# Altium project PY32E407Vx_START_ETH.PrjPcb
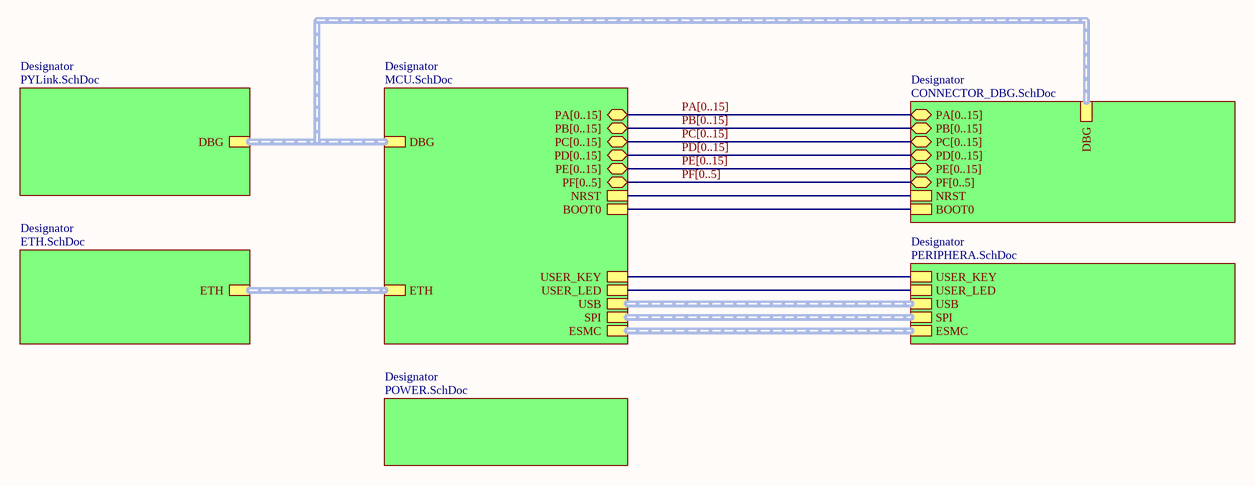
[diagram p0: TOP.SchDoc]
7 sheets, 253 parts. Net scope: hierarchical (ports join the sheet entries above them; power ports are global).
Board file: PY32E407Vx_START_ETH.PcbDoc
Sheets:
  TOP.SchDoc
    Designator = PYLink.SchDoc
    Designator = MCU.SchDoc
    Designator = ETH.SchDoc
    Designator = PERIPHERA.SchDoc
    Designator = CONNECTOR_DBG.SchDoc
    Designator = POWER.SchDoc

## Sheet TOP.SchDoc: TOP
size A4; Revision: V2.0; SheetNumber: 1; SheetTotal: 7; Project: PY32F403v1xT_START

### Sub-sheets
Designator = PYLink.SchDoc: DBG (harness QSPI)
Designator = MCU.SchDoc: PA[0..15] (bidir), PB[0..15] (bidir), PC[0..15] (bidir), PD[0..15] (bidir), PE[0..15] (bidir), NRST, BOOT0, ETH (harness QSPI), USB (harness QSPI), ESMC (harness QSPI), SPI (harness QSPI), DBG (harness QSPI), PF[0..5] (bidir), USER_KEY, USER_LED
Designator = ETH.SchDoc: ETH (harness QSPI)
Designator = PERIPHERA.SchDoc: USB (harness QSPI), ESMC (harness QSPI), SPI (harness QSPI), USER_KEY, USER_LED
Designator = CONNECTOR_DBG.SchDoc: PA[0..15] (bidir), PB[0..15] (bidir), PC[0..15] (bidir), PD[0..15] (bidir), PE[0..15] (bidir), NRST, BOOT0, DBG (harness QSPI), PF[0..5] (bidir)
Designator = POWER.SchDoc: no entries

### Nets
BOOT0: sheet Designator/BOOT0, sheet Designator/BOOT0
NRST: sheet Designator/NRST, sheet Designator/NRST
USER_KEY: sheet Designator/USER_KEY, sheet Designator/USER_KEY
USER_LED: sheet Designator/USER_LED, sheet Designator/USER_LED

### Buses and harness runs
bus PA[0..15] = sheet Designator/PA[0..15]
bus PB[0..15] = sheet Designator/PB[0..15]
bus PC[0..15] = sheet Designator/PC[0..15]
bus PD[0..15] = sheet Designator/PD[0..15]
bus PE[0..15] = sheet Designator/PE[0..15]
bus PF[0..5] = sheet Designator/PF[0..5]

### Notes on the sheet
- Title:
- Project:
- Size:
- Sheet:
- A4
- of
- Date:
- Revision:

## Sheet PYLink.SchDoc: PYLink
size A3; DrawnBy: lcg; Revision: V2.0; SheetNumber: 2; SheetTotal: 7; Project: PY32F403v1xT_START
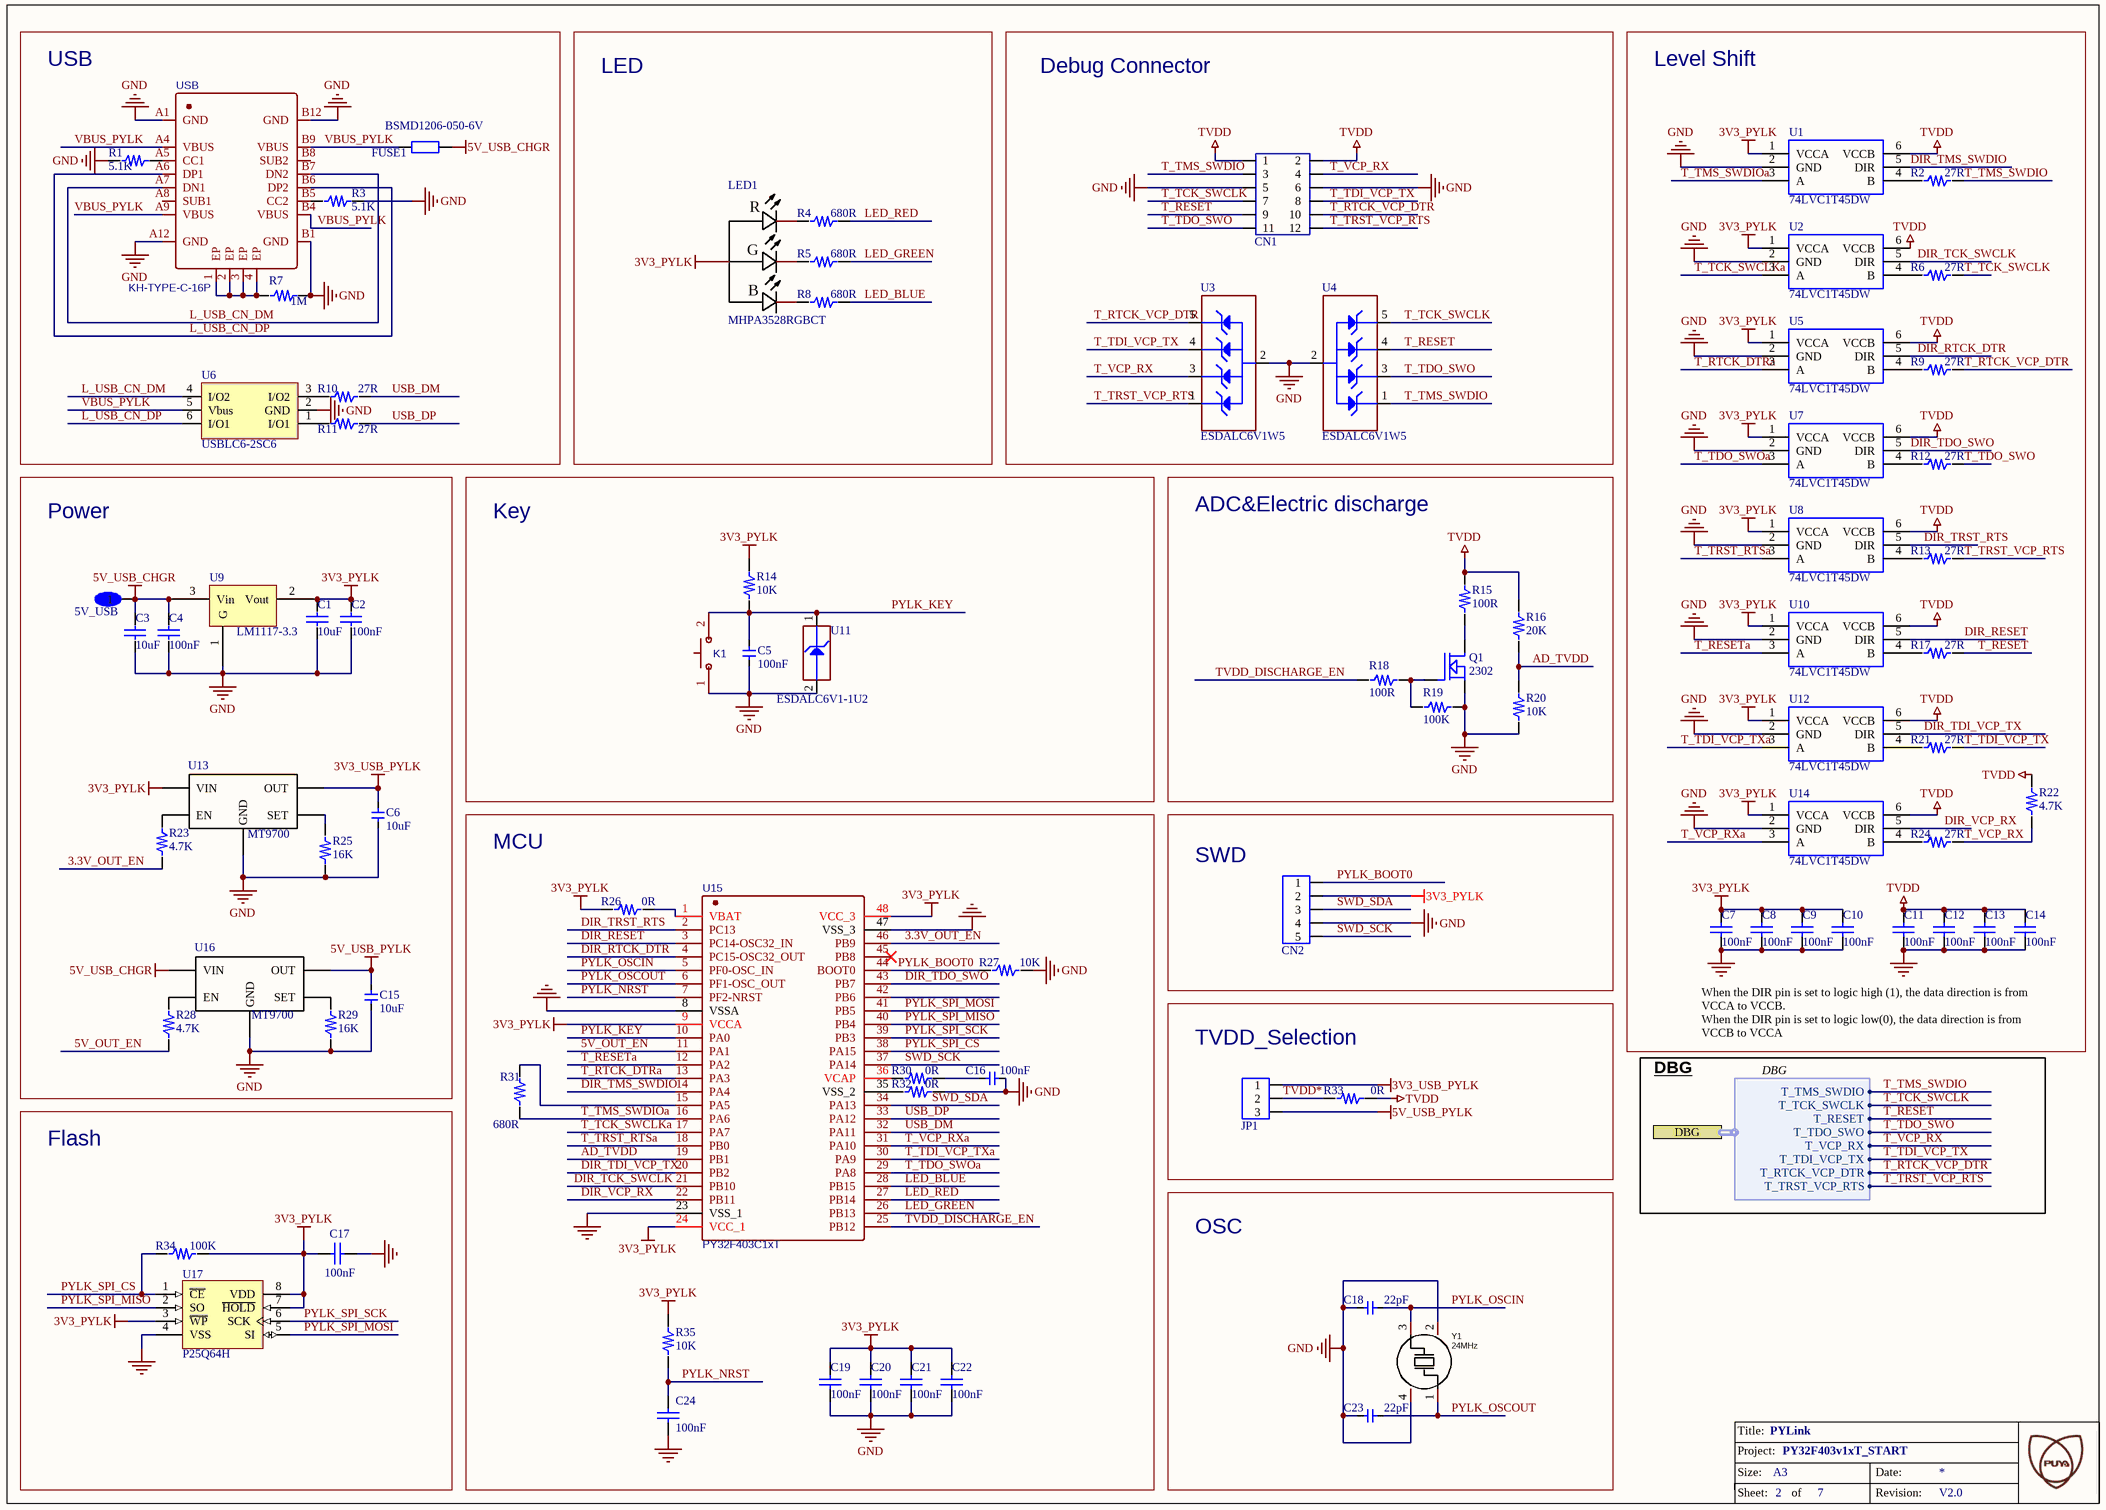
[diagram p1: PYLink.SchDoc]

### Parts
5V_USB  TP_SIN  [TP_SIN]  (value not drawn)
C1  10uF  [C0805]
C2  100nF  [C0603]
C3  10uF  [C0805]
C4  100nF  [C0603]
C5  100nF  [C0603]
C6  10uF  [C0805]
C7  100nF  [C0603]
C8  100nF  [C0603]
C9  100nF  [C0603]
C10  100nF  [C0603]
C11  100nF  [C0603]
C12  100nF  [C0603]
C13  100nF  [C0603]
C14  100nF  [C0603]
C15  10uF  [C0805]
C16  100nF  [C0603]
C17  100nF  [C0603]
C18  22pF  [C0603]
C19  100nF  [C0603]
C20  100nF  [C0603]
C21  100nF  [C0603]
C22  100nF  [C0603]
C23  22pF  [C0603]
C24  100nF  [C0603]
CN1  CON6x2  [CON6x2]  (value not drawn)
CN2  CON5  [CON5]  (value not drawn)
FUSE1  BSMD1206-050-6V  [SDM1210P005TF]
JP1  CON3  [CON3]  (value not drawn)
K1  1TS002B-2600-5001_key  [Switch]  (value not drawn)
LED1  MHPA3528RGBCT  [LED-ARRAY-SMD_4P-L3.5-W2.8-TL]
Q1  2302  [SOT23]
R1  5.1K  [R0603]
R2  27R  [R0603]
R3  5.1K  [R0603]
R4  680R  [R0603]
R5  680R  [R0603]
R6  27R  [R0603]
R7  1M  [R0603]
R8  680R  [R0603]
R9  27R  [R0603]
R10  27R  [R0603]
R11  27R  [R0603]
R12  27R  [R0603]
R13  27R  [R0603]
R14  10K  [R0603]
R15  100R  [R0805]
R16  20K  [R0603]
R17  27R  [R0603]
R18  100R  [R0603]
R19  100K  [R0603]
R20  10K  [R0603]
R21  27R  [R0603]
R22  4.7K  [R0603]
R23  4.7K  [R0603]
R24  27R  [R0603]
R25  16K  [R0603]
R26  0R  [R0603]
R27  10K  [R0603]
R28  4.7K  [R0603]
R29  16K  [R0603]
R30  0R  [R0603]
R31  680R  [R0603]
R32  0R  [R0603]
R33  0R  [R0603]
R34  100K  [R0603]
R35  10K  [R0603]
U1  74LVC1T45DW  [SOT363]
U2  74LVC1T45DW  [SOT363]
U3  value ESDALC6V1W5  [ESD_SOT323-5L]  (hidden comment: ESD_6V1)
U4  value ESDALC6V1W5  [ESD_SOT323-5L]  (hidden comment: ESD_6V1)
U5  74LVC1T45DW  [SOT363]
U6  USBLC6-2SC6  [SOT23-6]
U7  74LVC1T45DW  [SOT363]
U8  74LVC1T45DW  [SOT363]
U9  LM1117-3.3  [LM1117-3.3]
U10  74LVC1T45DW  [SOT363]
U11  value ESDALC6V1-1U2  [ESD_ST0201]  (hidden comment: ESD-TRANSIL)
U12  74LVC1T45DW  [SOT363]
U13  MT9700  [SOT23-5]
U14  74LVC1T45DW  [SOT363]
U15  PY32F403C1xT  [LQFP-48_L7.0-W7.0-P0.50-LS9.0-BL]
U16  MT9700  [SOT23-5]
U17  P25Q64H  [SOP-8P]
USB  KH-TYPE-C-16P  [USB-C-SMD_KH-TYPE-C-16P]
Y1  24MHz  [CRYSTAL-SMD_4P-L3.2-W2.5-BL]

### Blocks framed on the sheet
USB: FUSE1 R1 R3 R7 R10 R11 U6 USB
LED: LED1 R4 R5 R8
Debug Connector: CN1 U3 U4
Level Shift: C7-C14 R2 R6 R9 R12 R13 R17 R21 R22 R24 U1 U2 U5 U7 U8 U10 U12 U14
Power: 5V_USB C1-C4 C6 C15 R23 R25 R28 R29 U9 U13 U16
Key: C5 K1 R14 U11
ADC&Electric discharge: Q1 R15 R16 R18-R20
MCU: C16 C19-C22 C24 R26 R27 R30-R32 R35 U15
SWD: CN2
TVDD_Selection: JP1 R33
Flash: C17 R34 U17
OSC: C18 C23 Y1

### Ports
DBG (harness DBG)

### Harnesses
DBG: T_VCP_RX, T_TDO_SWO, T_RESET, T_TMS_SWDIO, T_TDI_VCP_TX, T_TCK_SWCLK, T_RTCK_VCP_DTR, T_TRST_VCP_RTS

### Nets
3V3_PYLK: C1.2 C2.2 C7.2 C8.2 C9.2 C10.2 C17.2 C19.2 C20.2 C21.2 C22.2 CN2.2 LED1.1(-) R14.2 R26.1 R34.2 R35.2 U1.1(VCCA) U2.1(VCCA) U5.1(VCCA) U7.1(VCCA) U8.1(VCCA) U9.2(Vout) U10.1(VCCA) U12.1(VCCA) U13.5(VIN) U14.1(VCCA) U15.9(VCCA) U15.24(VCC_1) U15.48(VCC_3) U17.3(~{WP}) U17.7(~{HOLD}) U17.8(VDD)
3V3_USB_PYLK: C6.2 JP1.1 U13.1(OUT)
5V_USB_CHGR: 5V_USB.1 C3.2 C4.2 FUSE1.2 U9.3(Vin) U16.5(VIN)
5V_USB_PYLK: C15.2 JP1.3 U16.1(OUT)
GND: C1.1 C2.1 C3.1 C4.1 C5.1 C6.1 C7.1 C8.1 C9.1 C10.1 C11.1 C12.1 C13.1 C14.1 C15.1 C16.1 C17.1 C18.1 C19.1 C20.1 C21.1 C22.1 C23.1 C24.1 CN1.5 CN1.6 CN2.4 K1.1(A) Q1.2(S) R1.1 R3.2 R7.2 R19.1 R20.1 R25.1 R27.2 R29.1 R32.2 U1.2(GND) U2.2(GND) U3.2(GND) U4.2(GND) U5.2(GND) U6.2(GND) U7.2(GND) U8.2(GND) U9.1(G) U10.2(GND) U11.2(GND) U12.2(GND) U13.2(GND) U14.2(GND) U15.8(VSSA) U15.23(VSS_1) U15.47(VSS_3) U16.2(GND) U17.4(VSS) USB.A1(GND) USB.A12(GND) USB.B1(GND) USB.B12(GND) Y1.2(GND) Y1.4(GND)
TVDD: C11.2 C12.2 C13.2 C14.2 CN1.1 CN1.2 R15.2 R16.2 R22.2 R33.2 U1.6(VCCB) U2.6(VCCB) U5.6(VCCB) U7.6(VCCB) U8.6(VCCB) U10.6(VCCB) U12.6(VCCB) U14.6(VCCB)
3.3V_OUT_EN: R23.1 U15.46(PB9)
5V_OUT_EN: R28.1 U15.11(PA1)
AD_TVDD: R16.1 R20.2 U15.19(PB1)
DIR_RESET: U10.5(DIR) U15.3(PC14-OSC32_IN)
DIR_RTCK_DTR: U5.5(DIR) U15.4(PC15-OSC32_OUT)
DIR_TCK_SWCLK: U2.5(DIR) U15.21(PB10)
DIR_TDI_VCP_TX: U12.5(DIR) U15.20(PB2)
DIR_TDO_SWO: U7.5(DIR) U15.43(PB7)
DIR_TMS_SWDIO: U1.5(DIR) U15.14(PA4)
DIR_TRST_RTS: U8.5(DIR) U15.2(PC13)
DIR_VCP_RX: U14.5(DIR) U15.22(PB11)
L_USB_CN_DM: U6.4(I/O2) USB.A7(DN1) USB.B7(DN2)
L_USB_CN_DP: U6.6(I/O1) USB.A6(DP1) USB.B6(DP2)
LED_BLUE: R8.2 U15.28(PB15)
LED_GREEN: R5.2 U15.26(PB13)
LED_RED: R4.2 U15.27(PB14)
PYLK_BOOT0: CN2.1 R27.1 U15.44(BOOT0)
PYLK_KEY: C5.2 K1.2(B) R14.1 U11.1(IO1) U15.10(PA0)
PYLK_NRST: C24.2 R35.1 U15.7(PF2-NRST)
PYLK_OSCIN: C18.2 U15.5(PF0-OSC_IN) Y1.3(OSC2)
PYLK_OSCOUT: C23.2 U15.6(PF1-OSC_OUT) Y1.1(OSC1)
PYLK_SPI_CS: R34.1 U15.38(PA15) U17.1(~{CE})
PYLK_SPI_MISO: U15.40(PB4) U17.2(SO)
PYLK_SPI_MOSI: U15.41(PB5) U17.5(SI)
PYLK_SPI_SCK: U15.39(PB3) U17.6(SCK)
SWD_SCK: CN2.5 U15.37(PA14)
SWD_SDA: CN2.3 U15.34(PA13)
T_RESET: CN1.9 R17.2 U4.4(IO3) ; port DBG.T_RESET
T_RESETa: U10.3(A) U15.12(PA2)
T_RTCK_DTRa: U5.3(A) U15.13(PA3)
T_RTCK_VCP_DTR: CN1.10 R9.2 U3.5(IO4) ; port DBG.T_RTCK_VCP_DTR
T_TCK_SWCLK: CN1.7 R6.2 U4.5(IO4) ; port DBG.T_TCK_SWCLK
T_TCK_SWCLKa: U2.3(A) U15.17(PA7)
T_TDI_VCP_TX: CN1.8 R21.2 U3.4(IO3) ; port DBG.T_TDI_VCP_TX
T_TDI_VCP_TXa: U12.3(A) U15.30(PA9)
T_TDO_SWO: CN1.11 R12.2 U4.3(IO2) ; port DBG.T_TDO_SWO
T_TDO_SWOa: U7.3(A) U15.29(PA8)
T_TMS_SWDIO: CN1.3 R2.2 U4.1(IO1) ; port DBG.T_TMS_SWDIO
T_TMS_SWDIOa: R31.1 U1.3(A) U15.16(PA6)
T_TRST_RTSa: U8.3(A) U15.18(PB0)
T_TRST_VCP_RTS: CN1.12 R13.2 U3.1(IO1) ; port DBG.T_TRST_VCP_RTS
T_VCP_RX: CN1.4 R22.1 R24.2 U3.3(IO2) ; port DBG.T_VCP_RX
T_VCP_RXa: U14.3(A) U15.31(PA10)
TVDD*: JP1.2 R33.1
TVDD_DISCHARGE_EN: R18.2 U15.25(PB12)
USB_DM: R10.2 U15.32(PA11)
USB_DP: R11.2 U15.33(PA12)
VBUS_PYLK: FUSE1.1 U6.5(Vbus) USB.A4(VBUS) USB.A9(VBUS) USB.B4(VBUS) USB.B9(VBUS)
NetC16_2: C16.2 R30.2
NetLED1_2: LED1.2(-) R8.1
NetLED1_3: LED1.3(-) R5.1
NetLED1_4: LED1.4(-) R4.1
NetQ1_1: Q1.1(G) R18.1 R19.2
NetQ1_3: Q1.3(D) R15.1
NetR1_2: R1.2 USB.A5(CC1)
NetR2_1: R2.1 U1.4(B)
NetR3_1: R3.1 USB.B5(CC2)
NetR6_1: R6.1 U2.4(B)
NetR7_1: R7.1 USB.1(EP) USB.2(EP) USB.3(EP) USB.4(EP)
NetR9_1: R9.1 U5.4(B)
NetR10_1: R10.1 U6.3(I/O2)
NetR11_1: R11.1 U6.1(I/O1)
NetR12_1: R12.1 U7.4(B)
NetR13_1: R13.1 U8.4(B)
NetR17_1: R17.1 U10.4(B)
NetR21_1: R21.1 U12.4(B)
NetR23_2: R23.2 U13.4(EN)
NetR24_1: R24.1 U14.4(B)
NetR25_2: R25.2 U13.3(SET)
NetR26_2: R26.2 U15.1(VBAT)
NetR28_2: R28.2 U16.4(EN)
NetR29_2: R29.2 U16.3(SET)
NetR30_1: R30.1 U15.36(VCAP)
NetR31_2: R31.2 U15.15(PA5)
NetR32_1: R32.1 U15.35(VSS_2)

Not connected (* = marked no-connect by the designer): U15 42(PB6) 45(PB8)*; USB A8(SUB1) B8(SUB2)

### Notes on the sheet
- When the DIR pin is set to logic high (1), the data direction is from VCCA to VCCB.
  When the DIR pin is set to logic low(0), the data direction is from VCCB to VCCA
- DBG
- Title:
- Project:
- Size:
- Sheet:
- A3
- of
- Date:
- Revision:
- (in symbol MHPA3528RGBCT) R; G; B

### Library data of the parts
C1 C3 C6 C15 = C0805: PCB DECAL: 0805
C2 C4 C5 C16 C18 C23 = C0603: PCB DECAL: 0603
C7-C14 C17 C19-C22 C24 = 贴片高压陶瓷电容: Capacitor (Semiconductor SIM Model); 器件封装(外观): 0603; Value: 104
CN1 = CON6x2: PCB DECAL: CON5x2
FUSE1 = SMD1210P005TF: https://item.szlcsc.com/947797.html?fromZone=s_s__%25226V%2520500mA%2522; ComponentLink1Description: lichang; ComponentLink1URL: C883122
K1 = 1TS002B-2600-5001_key: BOM_Manufacturer: HYP; Contributor: LCSC; BOM_Supplier: LCSC; BOM_Supplier Part: C319334; BOM_Manufacturer Part: 1TS002B-2600-5001_KEY; BOM_JLCPCB Part Class: Extended Part; spicePre: S; spiceSymbolName: 1TS002B-2600-5001
LED1 = MHPA3528RGBCT: Manufacturer: MEIHUA(美华); Add into BOM: yes; Symbol: MHPA3528RGBCT; Device: MHPA3528RGBCT; LCSC Part Name: RGB三色; Supplier Part: C409779; Manufacturer Part: MHPA3528RGBCT; Supplier Footprint: SMD3528; JLCPCB Part Class: 扩展库; Datasheet: https://atta.szlcsc.com/upload/public/pdf/source/20190902/C409779_9EA0C46D876E94D2A4E683BAC3DDD702.pdf; Supplier: LCSC; Convert to PCB: yes; Name: MHPA3528RGBCT
Q1 = MOSFET N: Value: SI2302; 器件封装(外观): SOT23
R1-R14 R16-R35 = R0603: PCB DECAL: 0603
R15 = R0805: PCB DECAL: 0805
U3 U4 = ESDALC6V1W5: Dual Transil array for ESD protection; Internal_Part_Number: MCD-00136; Part_Type: Diode; Manufacturer: STMICROELECTRONICS; ECCN_US: EAR99; ECCN_EU: NEC; Provided_By: Subcon; Initial_Board_Reference: MB1262; Status: Released; Manufacturer_Part_Number: ESDALC6V1W5; ComponentLink1Description: STM_ESD_ESDALC6V1W5.pdf; ComponentLink1URL: http://tunmcdsvn.tun.st.com/Component_Datasheet_Library/Trunk/Diodes/STM_ESD_ESDALC6V1W5
U6 = USBLC6-2SC6: Function: ESD EMI fliter
U11 = ESD-TRANSIL: ESD protection 6V1; Internal_Part_Number: MCD-00170; Part_Type: Diode; Manufacturer: STMICROELECTRONICS; ECCN_US: EAR99; ECCN_EU: NEC; Provided_By: Subcon; Initial_Board_Reference: MB1274; Status: Released; Manufacturer_Part_Number: ESDALC6V1-1U2; ComponentLink1Description: STM_ESD_ESDALC6V1-1U2.pdf; ComponentLink1URL: http://tunmcdsvn.tun.st.com/Component_Datasheet_Library/Trunk/Diodes/STM_ESD_ESDALC6V1-1U2
U15 = PY32F403C1xT: LQFP48; BOM_Manufacturer: PUYA(普冉); BOM_Manufacturer Part: PY32F403C1xT; spicePre: U; spiceSymbolName: PY32F403C1xT
U17 = SST25VF010: Value: SST25VF020B; 器件封装(外观): SOP8
USB = KH-TYPE-C-16P: BOM_Manufacturer: Shenzhen Kinghelm Elec; Contributor: LCSC; BOM_Supplier: LCSC; BOM_Supplier Part: C709357; BOM_Manufacturer Part: KH-TYPE-C-16P; BOM_JLCPCB Part Class: Extended Part; spicePre: U; spiceSymbolName: KH-TYPE-C-16P
Y1 = ABM8AIG-24.000MHZ-82Z-T: ±20ppm , 12.5pF , T_use: -40°C~125°C; Manufacturer: ABRACON; Add into BOM: yes; External load capacitor: 8pF; Frequency Stability(Full temperature range): ±50ppm; Equivalent Series Resistance (ESR): 50Ω; Name: 24MHz; Symbol: ABM8AIG-24.000MHZ-82Z-T; Device: ABM8AIG-24.000MHZ-82Z-T; LCSC Part Name: 24MHz ±20ppm 8pF; Supplier Part: C1669761; Manufacturer Part: ABM8AIG-24.000MHZ-82Z-T; Supplier Footprint: SMD3225-4P; JLCPCB Part Class: Extended Part; Datasheet: https://atta.szlcsc.com/upload/public/pdf/source/20210326/C1986479_1F0B0D93791ADB7A90489BA856D17A98.pdf; Supplier: LCSC; Convert to PCB: yes; Value: 24MHz; Normal temperature Frequency Tolerance: ±20ppm; Operating Temperature: -40℃~+125℃

## Sheet MCU.SchDoc: MCU
size A3; Revision: V2.0; SheetNumber: 3; SheetTotal: 7; Project: PY32F403v1xT_START
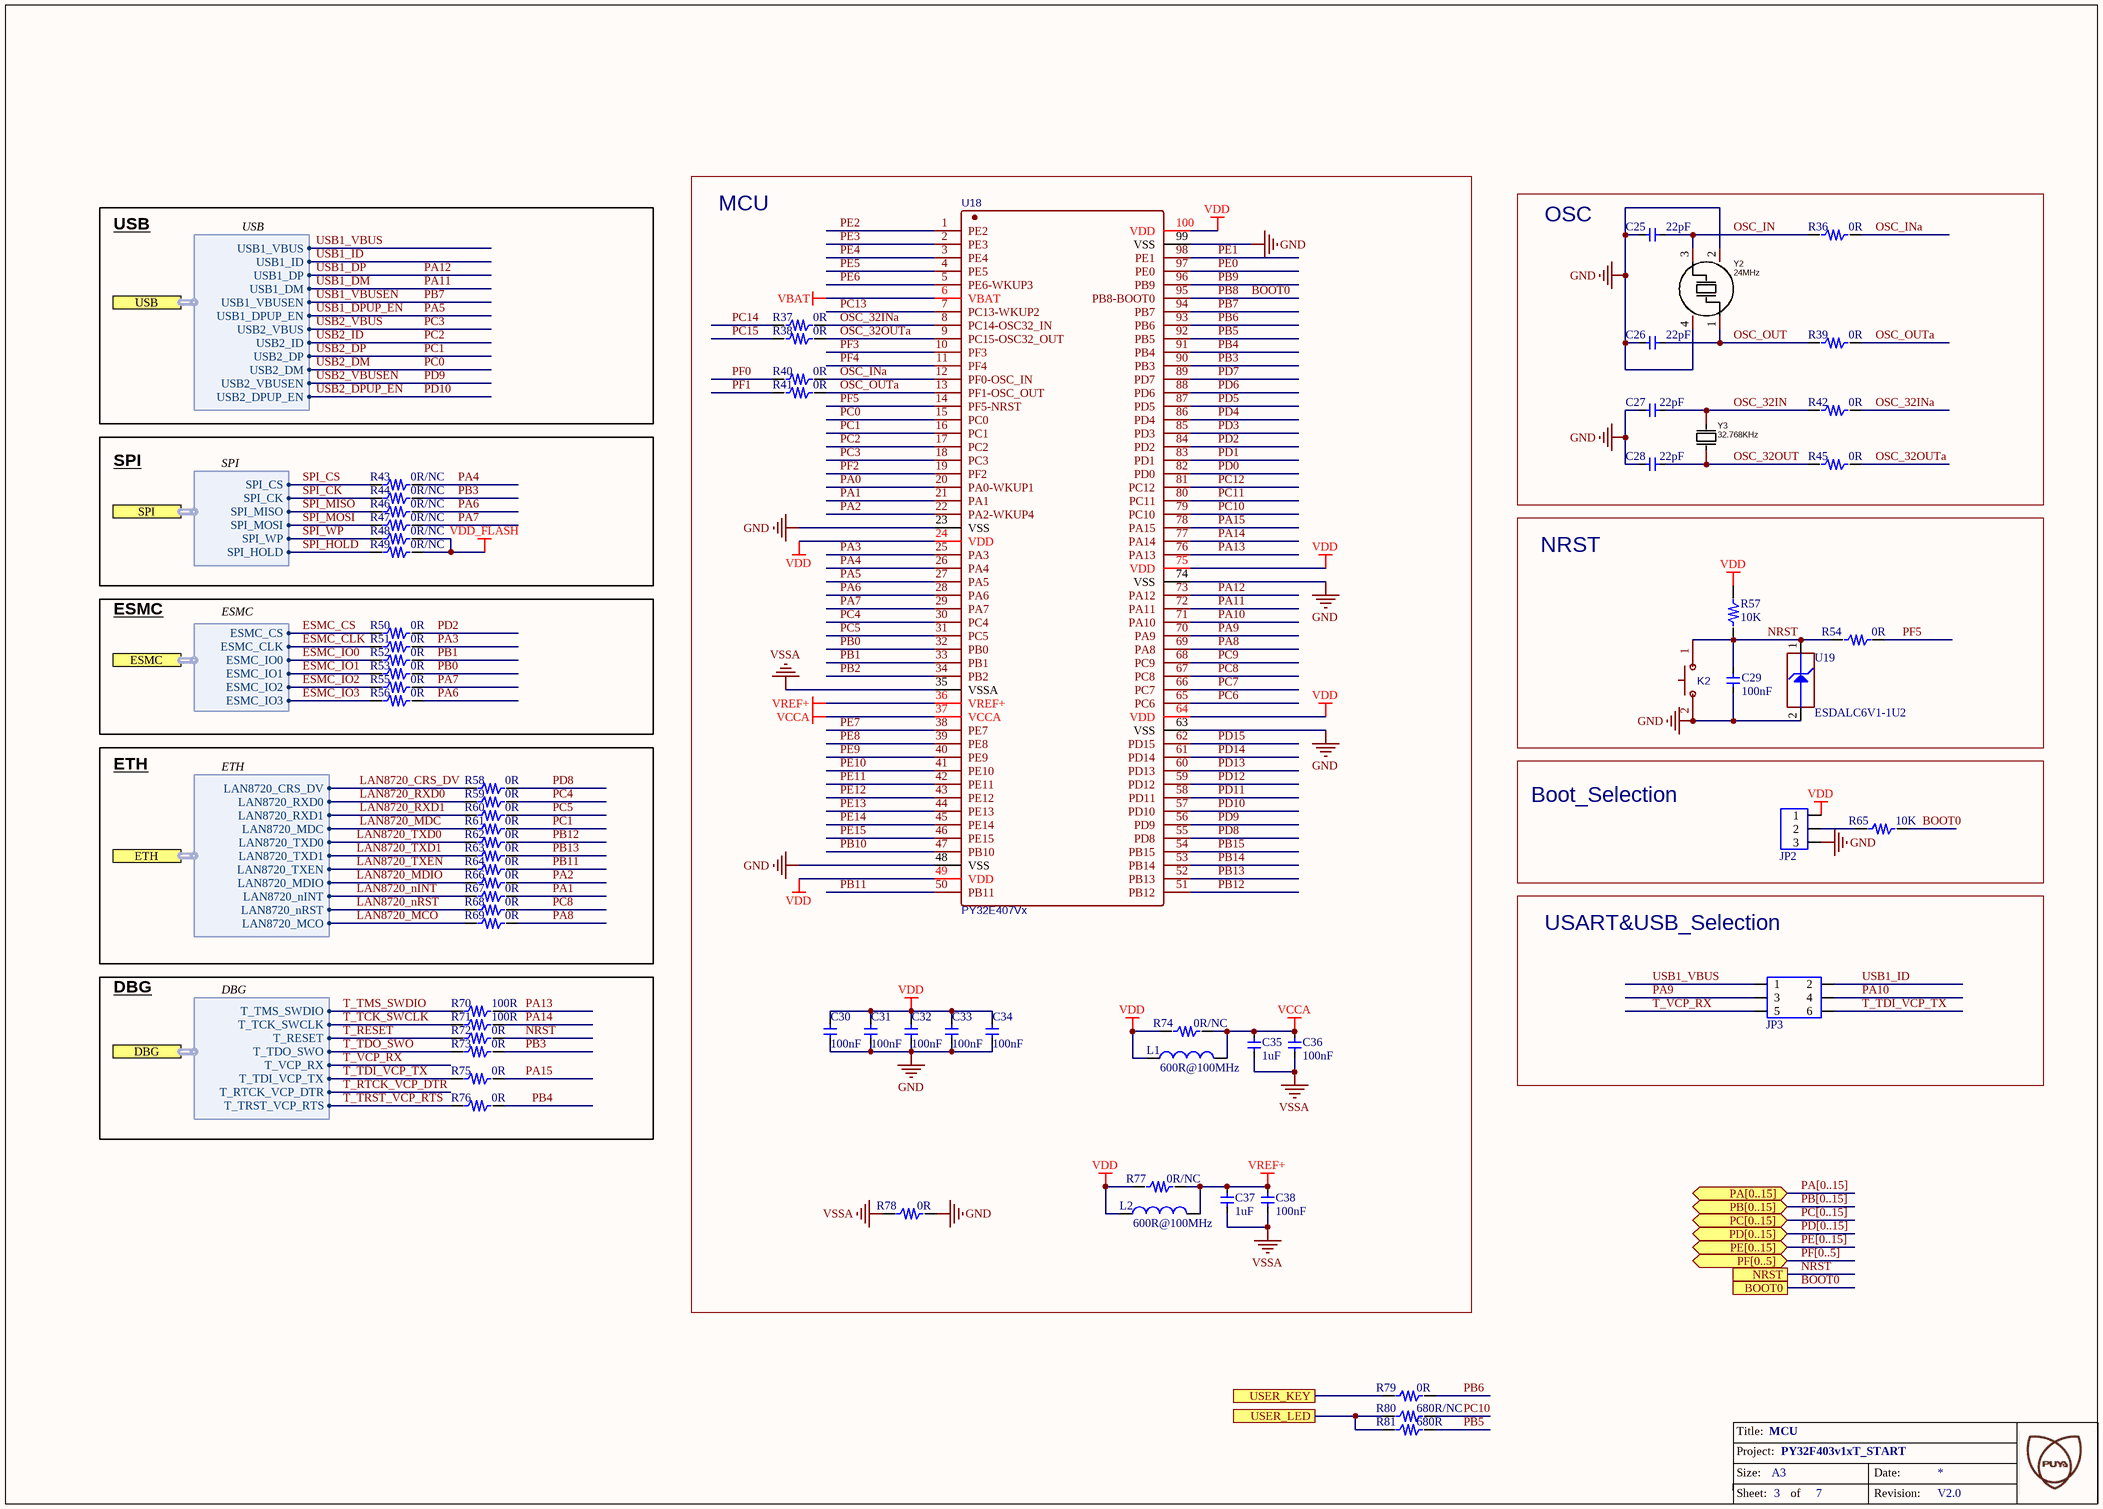
[diagram p2: MCU.SchDoc]

### Parts
C25  22pF  [C0603]
C26  22pF  [C0603]
C27  22pF  [C0603]
C28  22pF  [C0603]
C29  100nF  [C0603]
C30  100nF  [C0603]
C31  100nF  [C0603]
C32  100nF  [C0603]
C33  100nF  [C0603]
C34  100nF  [C0603]
C35  1uF  [C0805]
C36  100nF  [C0603]
C37  1uF  [C0805]
C38  100nF  [C0603]
JP2  CON3  [CON3]  (value not drawn)
JP3  CON3x2  [CON3x2]  (value not drawn)
K2  1TS002B-2600-5001_key  [Switch]  (value not drawn)
L1  value 600R@100MHz  [L0603]  (hidden comment: BEAD)
L2  value 600R@100MHz  [L0603]  (hidden comment: BEAD)
R36  0R  [R0603]
R37  0R  [R0603]
R38  0R  [R0603]
R39  0R  [R0603]
R40  0R  [R0603]
R41  0R  [R0603]
R42  0R  [R0603]
R43  0R/NC  [R0603]
R44  0R/NC  [R0603]
R45  0R  [R0603]
R46  0R/NC  [R0603]
R47  0R/NC  [R0603]
R48  0R/NC  [R0603]
R49  0R/NC  [R0603]
R50  0R  [R0603]
R51  0R  [R0603]
R52  0R  [R0603]
R53  0R  [R0603]
R54  0R  [R0603]
R55  0R  [R0603]
R56  0R  [R0603]
R57  10K  [R0603]
R58  0R  [R0603]
R59  0R  [R0603]
R60  0R  [R0603]
R61  0R  [R0603]
R62  0R  [R0603]
R63  0R  [R0603]
R64  0R  [R0603]
R65  10K  [R0603]
R66  0R  [R0603]
R67  0R  [R0603]
R68  0R  [R0603]
R69  0R  [R0603]
R70  100R  [R0603]
R71  100R  [R0603]
R72  0R  [R0603]
R73  0R  [R0603]
R74  0R/NC  [R0603]
R75  0R  [R0603]
R76  0R  [R0603]
R77  0R/NC  [R0603]
R78  0R  [R0603]
R79  0R  [R0603]
R80  680R/NC  [R0603]
R81  680R  [R0603]
U18  PY32E407Vx  [LQFP-100_L14.0-W14.0-P0.50-LS16.0-BL]
U19  value ESDALC6V1-1U2  [ESD_ST0201]  (hidden comment: ESD-TRANSIL)
Y2  24MHz  [CRYSTAL-SMD_4P-L3.2-W2.5-BL]
Y3  32.768KHz  [CRYSTAL-SMD_L3.2-W1.5-1]

### Blocks framed on the sheet
MCU: C30-C38 L1 L2 R37 R38 R40 R41 R74 R77 R78 U18
OSC: C25-C28 R36 R39 R42 R45 Y2 Y3
SPI: R43 R44 R46-R49
NRST: C29 K2 R54 R57 U19
ESMC: R50-R53 R55 R56
ETH: R58-R64 R66-R69
Boot_Selection: JP2 R65
USART&USB_Selection: JP3
DBG: R70-R73 R75 R76

### Ports
BOOT0, DBG (harness DBG), ESMC (harness ESMC), ETH (harness ETH), NRST, PA[0..15] (bidir), PB[0..15] (bidir), PC[0..15] (bidir), PD[0..15] (bidir), PE[0..15] (bidir), PF[0..5] (bidir), SPI (harness SPI), USB (harness USB), USER_KEY, USER_LED

### Harnesses
ETH: LAN8720_TXD0, LAN8720_MDC, LAN8720_RXD1, LAN8720_CRS_DV, LAN8720_TXD1, LAN8720_TXEN, LAN8720_nINT, LAN8720_MDIO, LAN8720_nRST, LAN8720_RXD0, LAN8720_MCO
ESMC: ESMC_IO2, ESMC_IO1, ESMC_IO0, ESMC_CS, ESMC_IO3, ESMC_CLK
DBG: T_VCP_RX, T_TDO_SWO, T_RESET, T_TMS_SWDIO, T_TDI_VCP_TX, T_TCK_SWCLK, T_RTCK_VCP_DTR, T_TRST_VCP_RTS
USB: USB2_VBUS, USB1_DM, USB1_DP, USB1_VBUS, USB2_ID, USB2_DP, USB2_DM, USB1_ID, USB2_VBUSEN, USB1_VBUSEN, USB1_DPUP_EN, USB2_DPUP_EN
SPI: SPI_MOSI, SPI_MISO, SPI_CS, SPI_CK, SPI_WP, SPI_HOLD

### Nets
GND: C25.1 C26.1 C27.1 C28.1 C29.1 C30.1 C31.1 C32.1 C33.1 C34.1 JP2.3 K2.2(B) R78.2 U18.23(VSS) U18.48(VSS) U18.63(VSS) U18.74(VSS) U18.99(VSS) U19.2(GND) Y2.2(GND) Y2.4(GND)
VBAT: U18.6(VBAT)
VCCA: C35.2 C36.2 L1.2 R74.2 U18.37(VCCA)
VDD: C30.2 C31.2 C32.2 C33.2 C34.2 JP2.1 L1.1 L2.1 R57.1 R74.1 R77.1 U18.24(VDD) U18.49(VDD) U18.64(VDD) U18.75(VDD) U18.100(VDD)
VDD_FLASH: R48.2 R49.2
VREF+: C37.2 C38.2 L2.2 R77.2 U18.36(VREF+)
VSSA: C35.1 C36.1 C37.1 C38.1 R78.1 U18.35(VSSA)
BOOT0: R65.2 U18.95(PB8-BOOT0) ; port BOOT0  [also labelled PB8]
ESMC_CLK: R44.1 R51.1 ; port ESMC.ESMC_CLK, port SPI.SPI_CK  [also labelled SPI_CK]
ESMC_CS: R43.1 R50.1 ; port ESMC.ESMC_CS, port SPI.SPI_CS  [also labelled SPI_CS]
ESMC_IO0: R47.1 R52.1 ; port ESMC.ESMC_IO0, port SPI.SPI_MOSI  [also labelled SPI_MOSI]
ESMC_IO1: R46.1 R53.1 ; port ESMC.ESMC_IO1, port SPI.SPI_MISO  [also labelled SPI_MISO]
ESMC_IO2: R48.1 R55.1 ; port ESMC.ESMC_IO2, port SPI.SPI_WP  [also labelled SPI_WP]
ESMC_IO3: R49.1 R56.1 ; port ESMC.ESMC_IO3, port SPI.SPI_HOLD  [also labelled SPI_HOLD]
LAN8720_CRS_DV: R58.1 ; port ETH.LAN8720_CRS_DV
LAN8720_MCO: R69.1 ; port ETH.LAN8720_MCO
LAN8720_MDC: R61.1 ; port ETH.LAN8720_MDC
LAN8720_MDIO: R66.1 ; port ETH.LAN8720_MDIO
LAN8720_nINT: R67.1 ; port ETH.LAN8720_nINT
LAN8720_nRST: R68.1 ; port ETH.LAN8720_nRST
LAN8720_RXD0: R59.1 ; port ETH.LAN8720_RXD0
LAN8720_RXD1: R60.1 ; port ETH.LAN8720_RXD1
LAN8720_TXD0: R62.1 ; port ETH.LAN8720_TXD0
LAN8720_TXD1: R63.1 ; port ETH.LAN8720_TXD1
LAN8720_TXEN: R64.1 ; port ETH.LAN8720_TXEN
NRST: C29.2 K2.1(A) R54.1 R57.2 R72.2 U19.1(IO1) ; port NRST
OSC_32IN: C27.2 R42.1 Y3.2(OSC2)
OSC_32INa: R37.2 R42.2 U18.8(PC14-OSC32_IN)
OSC_32OUT: C28.2 R45.1 Y3.1(OSC1)
OSC_32OUTa: R38.2 R45.2 U18.9(PC15-OSC32_OUT)
OSC_IN: C25.2 R36.1 Y2.3(OSC2)
OSC_INa: R36.2 R40.2 U18.12(PF0-OSC_IN)
OSC_OUT: C26.2 R39.1 Y2.1(OSC1)
OSC_OUTa: R39.2 R41.2 U18.13(PF1-OSC_OUT)
PA0: U18.20(PA0-WKUP1)
PA1: R67.2 U18.21(PA1)
PA2: R66.2 U18.22(PA2-WKUP4)
PA3: R51.2 U18.25(PA3)
PA4: R43.2 U18.26(PA4)
PA5: U18.27(PA5) ; port USB.USB1_DPUP_EN  [also labelled USB1_DPUP_EN]
PA6: R46.2 R56.2 U18.28(PA6)
PA7: R47.2 R55.2 U18.29(PA7)
PA8: R69.2 U18.69(PA8)
PA9: JP3.3 U18.70(PA9)
PA10: JP3.4 U18.71(PA10)
PA11: U18.72(PA11) ; port USB.USB1_DM  [also labelled USB1_DM]
PA12: U18.73(PA12) ; port USB.USB1_DP  [also labelled USB1_DP]
PA13: R70.2 U18.76(PA13)
PA14: R71.2 U18.77(PA14)
PA15: R75.2 U18.78(PA15)
PB0: R53.2 U18.32(PB0)
PB1: R52.2 U18.33(PB1)
PB2: U18.34(PB2)
PB3: R44.2 R73.2 U18.90(PB3)
PB4: R76.2 U18.91(PB4)
PB5: R81.2 U18.92(PB5)
PB6: R79.2 U18.93(PB6)
PB7: U18.94(PB7) ; port USB.USB1_VBUSEN  [also labelled USB1_VBUSEN]
PB9: U18.96(PB9)
PB10: U18.47(PB10)
PB11: R64.2 U18.50(PB11)
PB12: R62.2 U18.51(PB12)
PB13: R63.2 U18.52(PB13)
PB14: U18.53(PB14)
PB15: U18.54(PB15)
PC0: U18.15(PC0) ; port USB.USB2_DM  [also labelled USB2_DM]
PC1: R61.2 U18.16(PC1) ; port USB.USB2_DP  [also labelled USB2_DP]
PC2: U18.17(PC2) ; port USB.USB2_ID  [also labelled USB2_ID]
PC3: U18.18(PC3) ; port USB.USB2_VBUS  [also labelled USB2_VBUS]
PC4: R59.2 U18.30(PC4)
PC5: R60.2 U18.31(PC5)
PC6: U18.65(PC6)
PC7: U18.66(PC7)
PC8: R68.2 U18.67(PC8)
PC9: U18.68(PC9)
PC10: R80.2 U18.79(PC10)
PC11: U18.80(PC11)
PC12: U18.81(PC12)
PC13: U18.7(PC13-WKUP2)
PC14: R37.1
PC15: R38.1
PD0: U18.82(PD0)
PD1: U18.83(PD1)
PD2: R50.2 U18.84(PD2)
PD3: U18.85(PD3)
PD4: U18.86(PD4)
PD5: U18.87(PD5)
PD6: U18.88(PD6)
PD7: U18.89(PD7)
PD8: R58.2 U18.55(PD8)
PD9: U18.56(PD9) ; port USB.USB2_VBUSEN  [also labelled USB2_VBUSEN]
PD10: U18.57(PD10) ; port USB.USB2_DPUP_EN  [also labelled USB2_DPUP_EN]
PD11: U18.58(PD11)
PD12: U18.59(PD12)
PD13: U18.60(PD13)
PD14: U18.61(PD14)
PD15: U18.62(PD15)
PE0: U18.97(PE0)
PE1: U18.98(PE1)
PE2: U18.1(PE2)
PE3: U18.2(PE3)
PE4: U18.3(PE4)
PE5: U18.4(PE5)
PE6: U18.5(PE6-WKUP3)
PE7: U18.38(PE7)
PE8: U18.39(PE8)
PE9: U18.40(PE9)
PE10: U18.41(PE10)
PE11: U18.42(PE11)
PE12: U18.43(PE12)
PE13: U18.44(PE13)
PE14: U18.45(PE14)
PE15: U18.46(PE15)
PF0: R40.1
PF1: R41.1
PF2: U18.19(PF2)
PF3: U18.10(PF3)
PF4: U18.11(PF4)
PF5: R54.2 U18.14(PF5-NRST)
T_RESET: R72.1 ; port DBG.T_RESET
T_TCK_SWCLK: R71.1 ; port DBG.T_TCK_SWCLK
T_TDI_VCP_TX: JP3.6 R75.1 ; port DBG.T_TDI_VCP_TX
T_TDO_SWO: R73.1 ; port DBG.T_TDO_SWO
T_TMS_SWDIO: R70.1
T_TRST_VCP_RTS: R76.1 ; port DBG.T_TRST_VCP_RTS
T_VCP_RX: JP3.5 ; port DBG.T_VCP_RX
USB1_ID: JP3.2 ; port USB.USB1_ID
USB1_VBUS: JP3.1 ; port USB.USB1_VBUS
USER_KEY: R79.1 ; port USER_KEY
USER_LED: R80.1 R81.1 ; port USER_LED
NetJP2_2: JP2.2 R65.1

### Buses and harness runs
bus PA[0..15] = port PA[0..15]
bus PB[0..15] = port PB[0..15]
bus PC[0..15] = port PC[0..15]
bus PD[0..15] = port PD[0..15]
bus PE[0..15] = port PE[0..15]
bus PF[0..5] = port PF[0..5]

### Notes on the sheet
- USB
- Title:
- Project:
- Size:
- Sheet:
- A3
- of
- Date:
- Revision:

### Library data of the parts
C25-C34 C36 C38 = C0603: PCB DECAL: 0603
C35 C37 = C0805: PCB DECAL: 0805
JP3 = CON3x2: PCB DECAL: CON5x2
K2 = 1TS002B-2600-5001_key: BOM_Manufacturer: HYP; Contributor: LCSC; BOM_Supplier: LCSC; BOM_Supplier Part: C319334; BOM_Manufacturer Part: 1TS002B-2600-5001_KEY; BOM_JLCPCB Part Class: Extended Part; spicePre: S; spiceSymbolName: 1TS002B-2600-5001
L1 L2 = BEAD: SMD Chip ferrite bead, 600R@100MHz +/-25%, 350mA, 500mohm DC, 0603, T=0.8mm; Internal_Part_Number: MCD-00047; Part_Type: Inductor; Manufacturer_Part_Number: FCM1608KF-601T03; Manufacturer: TAI-TECH; Provided_By: SUBCO; Status: Released; ComponentLink1Description: Datasheet; ComponentLink1URL: http://tunmcdsvn.tun.st.com/Component_Datasheet_Library/Trunk/Inductors/TaiTech_Bead_FCM1608_series; ECCN_US: n/a; ECCN_EU: n/a
R36-R81 = R0603: PCB DECAL: 0603
U18 = PY32E407Vx: LQFP100; BOM_Manufacturer: PUYA(普冉); BOM_Manufacturer Part: PY32E407Vx; spicePre: U; spiceSymbolName: PY32E407Vx
U19 = ESD-TRANSIL: as U11 on sheet PYLink; Status: Released; Manufacturer_Part_Number: ESDALC6V1-1U2; ComponentLink1Description: STM_ESD_ESDALC6V1-1U2.pdf; ComponentLink1URL: http://tunmcdsvn.tun.st.com/Component_Datasheet_Library/Trunk/Diodes/STM_ESD_ESDALC6V1-1U2
Y2 = ABM8AIG-24.000MHZ-82Z-T: ±20ppm , 12.5pF , T_use: -40°C~85°C  C2682775; Manufacturer: ABRACON; Add into BOM: yes; External load capacitor: 8pF; Frequency Stability(Full temperature range): ±50ppm; Equivalent Series Resistance (ESR): 50Ω; Name: 24MHz; Symbol: ABM8AIG-24.000MHZ-82Z-T; Device: ABM8AIG-24.000MHZ-82Z-T; LCSC Part Name: 24MHz ±20ppm 8pF; Supplier Part: C1669761; Manufacturer Part: ABM8AIG-24.000MHZ-82Z-T; Supplier Footprint: SMD3225-4P; JLCPCB Part Class: Extended Part; Datasheet: https://atta.szlcsc.com/upload/public/pdf/source/20210326/C1986479_1F0B0D93791ADB7A90489BA856D17A98.pdf; Supplier: LCSC; Convert to PCB: yes; Value: 24MHz; Normal temperature Frequency Tolerance: ±20ppm; Operating Temperature: -40℃~+125℃
Y3 = XKXGI-SUA-32.768K: ±20ppm , 12.5pF , T_use: -40°C~125°C; Manufacturer: YXC(扬兴晶振); Add into BOM: yes; Crystal Type: 贴片晶振; Frequency Stability(Full temperature range): ±30ppm; Name: 32.768kHz; Symbol: XKXGI-SUA-32.768K; Device: XKXGI-SUA-32.768K; LCSC Part Name: 32.768kHz ±20ppm 12.5pF YST310S; Supplier Part: C5213671; Manufacturer Part: XKXGI-SUA-32.768K; Supplier Footprint: SMD3215-2P; JLCPCB Part Class: Extended Part; Datasheet: https://atta.szlcsc.com/upload/public/pdf/source/20240329/3A7650FD985DD0DE85694D3785AB4916.pdf; Supplier: LCSC; Convert to PCB: yes; Value: 32.768kHz; Normal temperature Frequency Tolerance: ±20ppm; External load capacitor: 12.5pF; Operating Temperature: -40℃~+85℃

## Sheet ETH.SchDoc: PERIPHERA
size A4; Revision: V2.0; SheetNumber: 5; SheetTotal: 7; Project: PY32F403v1xT_START
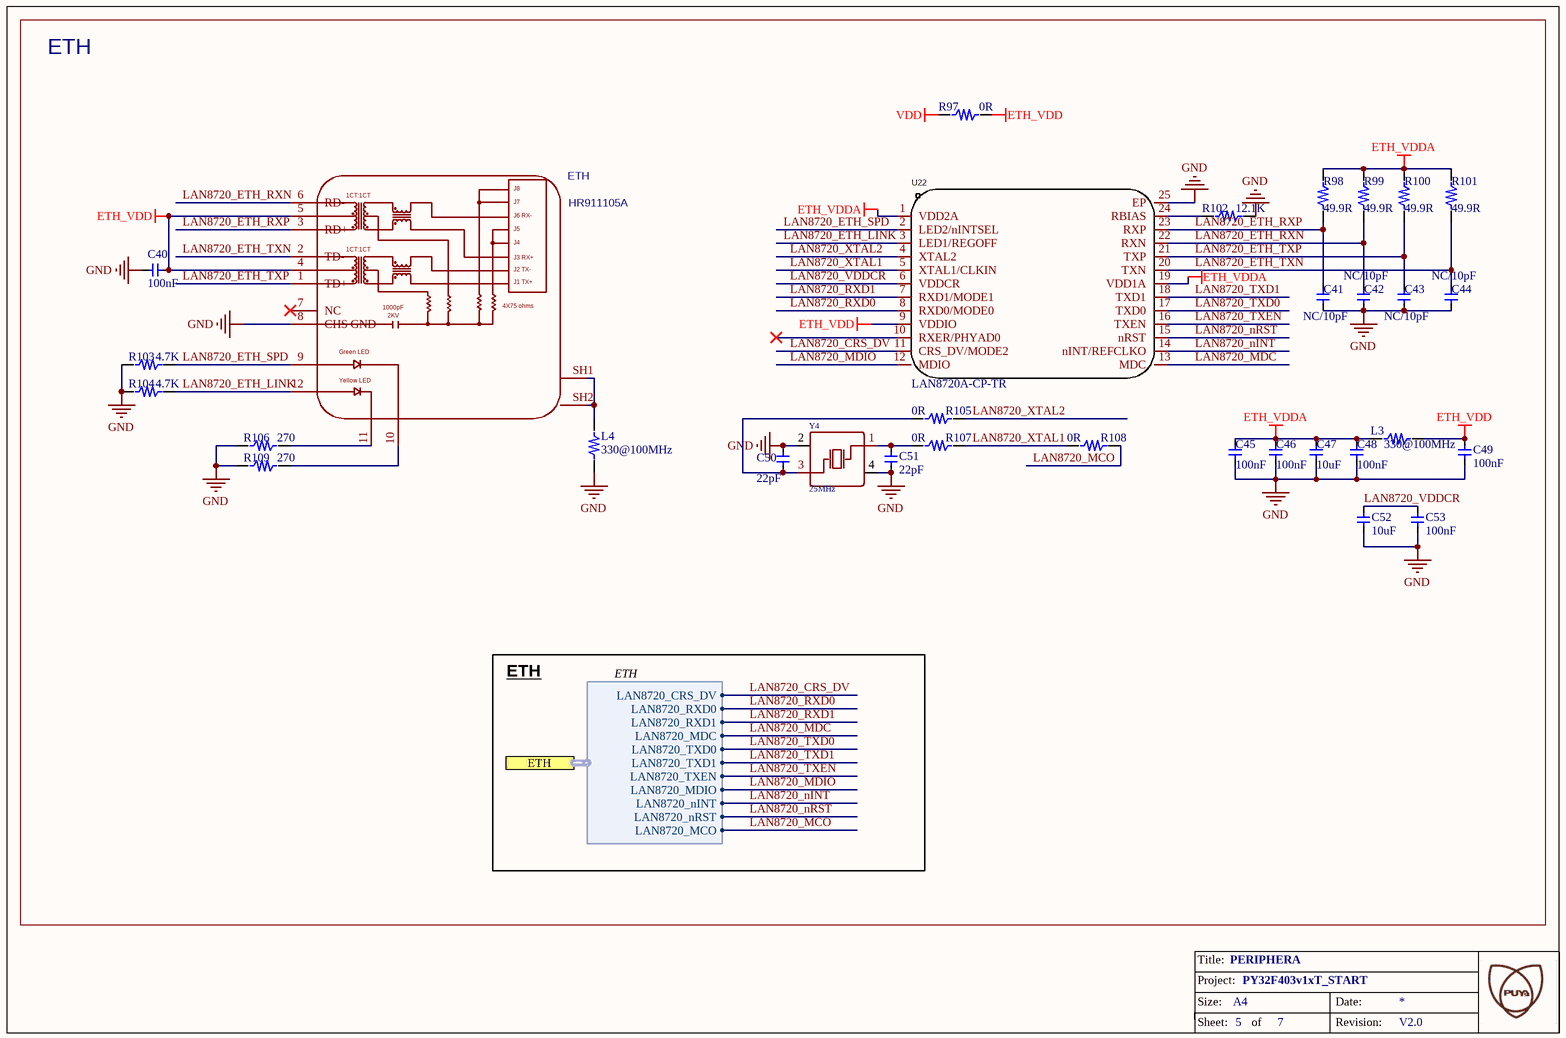
[diagram p3: ETH.SchDoc]

### Parts
C40  100nF  [C0603]
C41  NC/10pF  [C0603]
C42  NC/10pF  [C0603]
C43  NC/10pF  [C0603]
C44  NC/10pF  [C0603]
C45  100nF  [C0603]
C46  100nF  [C0603]
C47  10uF  [C0603]
C48  100nF  [C0603]
C49  100nF  [C0603]
C50  22pF  [C0603]
C51  22pF  [C0603]
C52  10uF  [C0603]
C53  100nF  [C0603]
ETH  HR911105A  [RJ45-TH_HR911105A]
L3  330@100MHz  [R0603]
L4  330@100MHz  [R0603]
R97  0R  [RES0603]
R98  49.9R  [R0603]
R99  49.9R  [R0603]
R100  49.9R  [R0603]
R101  49.9R  [R0603]
R102  12.1K  [R0603]
R103  4.7K  [R0603]
R104  4.7K  [R0603]
R105  0R  [R0603]
R106  270  [R0603]
R107  0R  [R0603]
R108  0R  [R0603]
R109  270  [R0603]
U22  LAN8720A-CP-TR  [QFN-24_L4.0-W4.0-P0.50-BL-EP2.6]
Y4  25MHz  [SMD-3225_4P]

### Ports
ETH (harness ETH)

### Harnesses
ETH: LAN8720_TXD0, LAN8720_MDC, LAN8720_RXD1, LAN8720_CRS_DV, LAN8720_TXD1, LAN8720_TXEN, LAN8720_nINT, LAN8720_MDIO, LAN8720_nRST, LAN8720_RXD0, LAN8720_MCO

### Nets
ETH_VDD: C40.2 C49.2 ETH.4 ETH.5 L3.2 R97.2 U22.9(VDDIO)
ETH_VDDA: C45.2 C46.2 C47.2 C48.2 L3.1 R98.2 R99.2 R100.2 R101.2 U22.1(VDD2A) U22.19(VDD1A)
GND: C40.1 C41.1 C42.1 C43.1 C44.1 C45.1 C46.1 C47.1 C48.1 C49.1 C50.2 C51.1 C52.1 C53.1 ETH.8(CHS_GND) L4.1 R102.2 R103.1 R104.1 R106.1 R109.1 U22.25(EP) Y4.2(GND) Y4.4(GND)
VDD: R97.1
LAN8720_CRS_DV: U22.11(CRS_DV/MODE2) ; port ETH.LAN8720_CRS_DV
LAN8720_ETH_LINK: ETH.12 R104.2 U22.3(LED1/REGOFF)
LAN8720_ETH_RXN: C42.2 ETH.6(RD-) R99.1 U22.22(RXN)
LAN8720_ETH_RXP: C41.2 ETH.3(RD+) R98.1 U22.23(RXP)
LAN8720_ETH_SPD: ETH.9 R103.2 U22.2(LED2/nINTSEL)
LAN8720_ETH_TXN: C44.2 ETH.2(TD-) R101.1 U22.20(TXN)
LAN8720_ETH_TXP: C43.2 ETH.1(TD+) R100.1 U22.21(TXP)
LAN8720_MCO: R108.2 ; port ETH.LAN8720_MCO
LAN8720_MDC: U22.13(MDC) ; port ETH.LAN8720_MDC
LAN8720_MDIO: U22.12(MDIO) ; port ETH.LAN8720_MDIO
LAN8720_nINT: U22.14(nINT/REFCLKO) ; port ETH.LAN8720_nINT
LAN8720_nRST: U22.15(nRST) ; port ETH.LAN8720_nRST
LAN8720_RXD0: U22.8(RXD0/MODE0) ; port ETH.LAN8720_RXD0
LAN8720_RXD1: U22.7(RXD1/MODE1) ; port ETH.LAN8720_RXD1
LAN8720_TXD0: U22.17(TXD0) ; port ETH.LAN8720_TXD0
LAN8720_TXD1: U22.18(TXD1) ; port ETH.LAN8720_TXD1
LAN8720_TXEN: U22.16(TXEN) ; port ETH.LAN8720_TXEN
LAN8720_VDDCR: C52.2 C53.2 U22.6(VDDCR)
LAN8720_XTAL1: R107.2 R108.1 U22.5(XTAL1/CLKIN)
LAN8720_XTAL2: R105.2 U22.4(XTAL2)
NetC50_1: C50.1 R105.1 Y4.3(OSC2)
NetC51_2: C51.2 R107.1 Y4.1(OSC1)
NetETH_10: ETH.10 R109.2
NetETH_11: ETH.11 R106.2
NetETH_SH1: ETH.SH1 ETH.SH2 L4.2
NetR102_1: R102.1 U22.24(RBIAS)

Not connected (* = marked no-connect by the designer): ETH 7(NC)*; U22 10(RXER/PHYAD0)*

### Notes on the sheet
- ETH
- Title:
- Project:
- Size:
- Sheet:
- A4
- of
- Date:
- Revision:
- (in symbol HR911105A_C12074) J8; 1CT:1CT; J7; J6 RX-; J5; J4; J3 RX+; J2 TX-; J1 TX+; 1000pF; 4X75 ohms; 2KV; Green LED; Yellow LED

### Library data of the parts
C40-C53 = C0603: PCB DECAL: 0603
ETH = HR911105A_C12074: Manufacturer: HANRUN; Contributor: 13471635540; Supplier: LCSC; Manufacturer Part: HR911105A; image: //image.lceda.cn/szlcsc/C12074.jpg; Supplier Part: C12074; spicePre: J; spiceSymbolName: HR911105A_C12074
L3 L4 R98-R109 = R0603: PCB DECAL: 0603
R97 = R0805: PCB DECAL: 0805
U22 = LAN8720A-CP-TR: 立创 C45223; Manufacturer: MICROCHIP(美国微芯); Add into BOM: yes; Application Function: 以太网收发器; Number of Channels: 1; Interface: RMII; Supply Voltage: 1.6V~3.6V; Name: LAN8720A-CP-TR; Symbol: LAN8720A-CP-TR; Device: LAN8720A-CP-TR; LCSC Part Name: LAN8720A-CP-TR; Supplier Part: C45223; Manufacturer Part: LAN8720A-CP-TR; Supplier Footprint: QFN-24-EP(4x4); JLCPCB Part Class: Extended Part; Datasheet: https://atta.szlcsc.com/upload/public/pdf/source/20151012/1457707444106.pdf; Supplier: LCSC; Convert to PCB: yes; Operating Temperature: 0℃~+85℃
Y4 = 12MHz: BOM_Manufacturer: TAE; BOM_Manufacturer Part: SMD-3225_4P12M20pf10ppm; nameAlias: Frequency; Contributor: LCSC; SMT Type: Extend; BOM_Supplier: LCSC; BOM_Supplier Part: C133334; BOM_LCSC Assembly: Yes; spicePre: X; spiceSymbolName: SMD-3225_4P12M20PF10PPM

## Sheet PERIPHERA.SchDoc: PERIPHERA
size A4; Revision: V2.0; SheetNumber: 7; SheetTotal: 7; Project: PY32F403v1xT_START
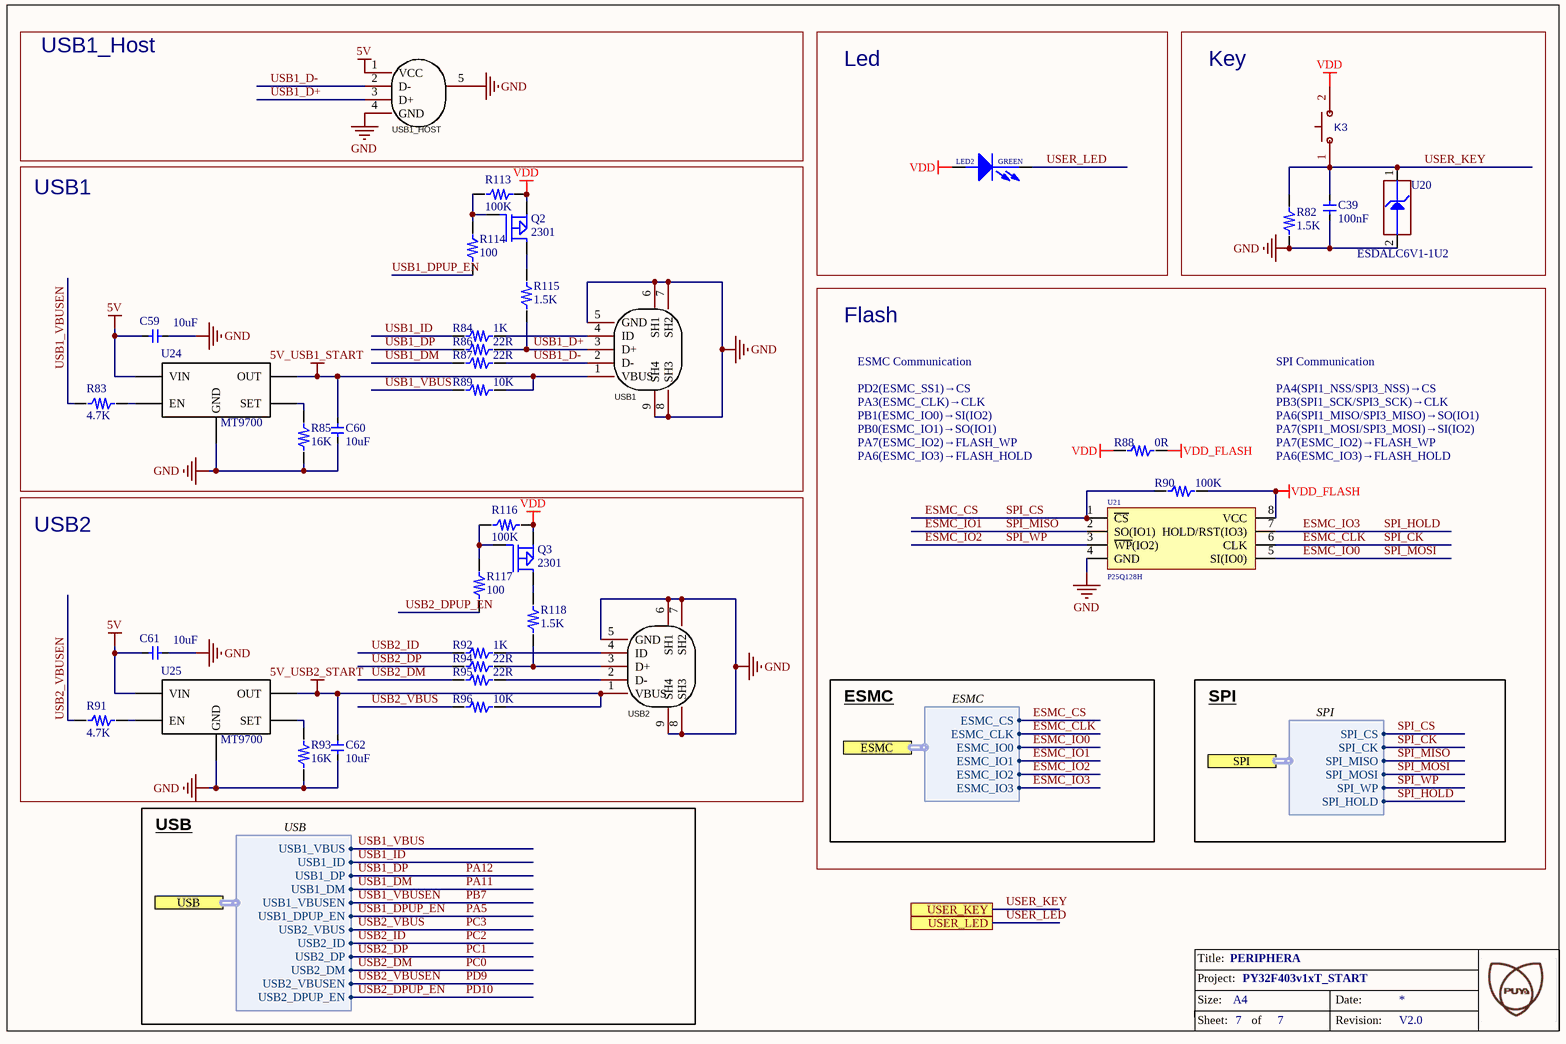
[diagram p4: PERIPHERA.SchDoc]

### Parts
C39  100nF  [C0603]
C59  10uF  [C0805]
C60  10uF  [C0805]
C61  10uF  [C0805]
C62  10uF  [C0805]
K3  1TS002B-2600-5001_key  [Switch]  (value not drawn)
LED2  GREEN  [0603_LED]
Q2  2301  [SOT23 2301]
Q3  2301  [SOT23 2301]
R82  1.5K  [R0603]
R83  4.7K  [R0603]
R84  1K  [R0603]
R85  16K  [R0603]
R86  22R  [R0603]
R87  22R  [R0603]
R88  0R  [R0603]
R89  10K  [R0603]
R90  100K  [R0603]
R91  4.7K  [R0603]
R92  1K  [R0603]
R93  16K  [R0603]
R94  22R  [R0603]
R95  22R  [R0603]
R96  10K  [R0603]
R113  100K  [R0603]
R114  100  [R0603]
R115  1.5K  [R0603]
R116  100K  [R0603]
R117  100  [R0603]
R118  1.5K  [R0603]
U20  value ESDALC6V1-1U2  [ESD_ST0201]  (hidden comment: ESD-TRANSIL)
U21  P25Q128H  [SOP8W_L]
U24  MT9700  [SOT23-5]
U25  MT9700  [SOT23-5]
USB1  Micro-B  [MICRO-USB-SMD_MICROXNJ]  (value not drawn)
USB1_HOST  Type-A  [USB-A-TH_AF-WJDG]  (value not drawn)
USB2  Micro-B  [MICRO-USB-SMD_MICROXNJ]  (value not drawn)

### Blocks framed on the sheet
USB1_Host: USB1_HOST
Led: LED2
Key: C39 K3 R82 U20
USB1: C59 C60 Q2 R83-R87 R89 R113-R115 U24 USB1
Flash: R88 R90 U21
USB2: C61 C62 Q3 R91-R96 R116-R118 U25 USB2

### Ports
ESMC (harness ESMC), SPI (harness SPI), USB (harness USB), USER_KEY, USER_LED

### Harnesses
ESMC: ESMC_IO2, ESMC_IO1, ESMC_IO0, ESMC_CS, ESMC_IO3, ESMC_CLK
SPI: SPI_MOSI, SPI_MISO, SPI_CS, SPI_CK, SPI_WP, SPI_HOLD
USB: USB2_VBUS, USB1_DM, USB1_DP, USB1_VBUS, USB2_ID, USB2_DP, USB2_DM, USB1_ID, USB2_VBUSEN, USB1_VBUSEN, USB1_DPUP_EN, USB2_DPUP_EN

### Nets
5V: C59.2 C61.2 U24.5(VIN) U25.5(VIN) USB1_HOST.1(VCC)
5V_USB1_START: C60.2 R89.2 U24.1(OUT) USB1.1(VBUS)
5V_USB2_START: C62.2 R96.2 U25.1(OUT) USB2.1(VBUS)
GND: C39.1 C59.1 C60.1 C61.1 C62.1 R82.1 R85.1 R93.1 U20.2(GND) U21.4(GND) U24.2(GND) U25.2(GND) USB1.5(GND) USB1.6(SH1) USB1.7(SH2) USB1.8(SH3) USB1.9(SH4) USB1_HOST.4(GND) USB1_HOST.5(SHLD) USB2.5(GND) USB2.6(SH1) USB2.7(SH2) USB2.8(SH3) USB2.9(SH4)
VDD: K3.2(B) LED2.1(ANODE) Q2.2(S) Q3.2(S) R88.1 R113.1 R116.1
VDD_FLASH: R88.2 R90.2 U21.8(VCC)
ESMC_CLK: U21.6(CLK) ; port ESMC.ESMC_CLK, port SPI.SPI_CK  [also labelled SPI_CK]
ESMC_CS: R90.1 U21.1(~{CS}) ; port ESMC.ESMC_CS, port SPI.SPI_CS  [also labelled SPI_CS]
ESMC_IO0: U21.5(SI(IO0)) ; port ESMC.ESMC_IO0, port SPI.SPI_MOSI  [also labelled SPI_MOSI]
ESMC_IO1: U21.2(SO(IO1)) ; port ESMC.ESMC_IO1, port SPI.SPI_MISO  [also labelled SPI_MISO]
ESMC_IO2: U21.3(~{WP}(IO2)) ; port ESMC.ESMC_IO2, port SPI.SPI_WP  [also labelled SPI_WP]
ESMC_IO3: U21.7(HOLD/RST(IO3)) ; port ESMC.ESMC_IO3, port SPI.SPI_HOLD  [also labelled SPI_HOLD]
PA5: R114.2 ; port USB.USB1_DPUP_EN  [also labelled USB1_DPUP_EN]
PA11: R87.1 ; port USB.USB1_DM  [also labelled USB1_DM]
PA12: R86.1 ; port USB.USB1_DP  [also labelled USB1_DP]
PB7: R83.1 ; port USB.USB1_VBUSEN  [also labelled USB1_VBUSEN]
PC0: R95.1 ; port USB.USB2_DM  [also labelled USB2_DM]
PC1: R94.1 ; port USB.USB2_DP  [also labelled USB2_DP]
PC2: R92.1 ; port USB.USB2_ID  [also labelled USB2_ID]
PC3: R96.1 ; port USB.USB2_VBUS  [also labelled USB2_VBUS]
PD9: R91.1 ; port USB.USB2_VBUSEN  [also labelled USB2_VBUSEN]
PD10: R117.2 ; port USB.USB2_DPUP_EN  [also labelled USB2_DPUP_EN]
USB1_D+: R86.2 R115.1 USB1.3(D+) USB1_HOST.3(D+)
USB1_D-: R87.2 USB1.2(D-) USB1_HOST.2(D-)
USB1_ID: R84.1 ; port USB.USB1_ID
USB1_VBUS: R89.1 ; port USB.USB1_VBUS
USER_KEY: C39.2 K3.1(A) R82.2 U20.1(IO1) ; port USER_KEY
USER_LED: LED2.2(CATHODE) ; port USER_LED
NetQ2_1: Q2.1(G) R113.2 R114.1
NetQ2_3: Q2.3(D) R115.2
NetQ3_1: Q3.1(G) R116.2 R117.1
NetQ3_3: Q3.3(D) R118.2
NetR83_2: R83.2 U24.4(EN)
NetR84_2: R84.2 USB1.4(ID)
NetR85_2: R85.2 U24.3(SET)
NetR91_2: R91.2 U25.4(EN)
NetR92_2: R92.2 USB2.4(ID)
NetR93_2: R93.2 U25.3(SET)
NetR94_2: R94.2 R118.1 USB2.3(D+)
NetR95_2: R95.2 USB2.2(D-)

### Notes on the sheet
- ESMC Communication
- SPI Communication
- PA3(ESMC_CLK)→CLK
- PB0(ESMC_IO1)→SO(IO1)
- PB1(ESMC_IO0)→SI(IO2)
- PD2(ESMC_SS1)→CS
- PA7(ESMC_IO2)→FLASH_WP
- PB3(SPI1_SCK/SPI3_SCK)→CLK
- PA6(SPI1_MISO/SPI3_MISO)→SO(IO1)
- PA7(SPI1_MOSI/SPI3_MOSI)→SI(IO2)
- PA4(SPI1_NSS/SPI3_NSS)→CS
- PA6(ESMC_IO3)→FLASH_HOLD
- ESMC
- SPI
- USB
- Title:
- Project:
- Size:
- Sheet:
- A4
- of
- Date:
- Revision:

### Library data of the parts
C39 = C0603: PCB DECAL: 0603
C59-C62 = C0805: PCB DECAL: 0805
K3 = 1TS002B-2600-5001_key: BOM_Manufacturer: HYP; Contributor: LCSC; BOM_Supplier: LCSC; BOM_Supplier Part: C319334; BOM_Manufacturer Part: 1TS002B-2600-5001_KEY; BOM_JLCPCB Part Class: Extended Part; spicePre: S; spiceSymbolName: 1TS002B-2600-5001
LED2 = PDI-E803_Dup1
Q2 Q3 = MOSFET P: Value: SI2301; 器件封装(外观): SOT23
R82-R96 R113-R118 = R0603: PCB DECAL: 0603
U20 = ESD-TRANSIL: as U11 on sheet PYLink; Status: Released; Manufacturer_Part_Number: ESDALC6V1-1U2; ComponentLink1Description: STM_ESD_ESDALC6V1-1U2.pdf; ComponentLink1URL: http://tunmcdsvn.tun.st.com/Component_Datasheet_Library/Trunk/Diodes/STM_ESD_ESDALC6V1-1U2
U21 = W25Q256: 外置flash
USB1 USB2 = MicroXNJ: Manufacturer: SHOU HAN(首韩); Add into BOM: yes; Gender: 母; Number of Ports: 1; Number of Contacts: 5P; Current Rating - Power (Max): 1A; Name: MicroXNJ; Symbol: MICROXNJ; Device: MicroXNJ; LCSC Part Name: Micro-B 母 卧贴; Supplier Part: C404969; Manufacturer Part: MicroXNJ; Supplier Footprint: SMD; JLCPCB Part Class: Extended Part; Datasheet: https://atta.szlcsc.com/upload/public/pdf/source/20220415/2494EDFF499AF6F852F7C820374B6AF3.pdf; Supplier: LCSC; Convert to PCB: yes; Connector Type: Micro-B; Standard: USB 2.0; Mounting Style: 卧贴; Operating Temperature Range: -20℃~+85℃
USB1_HOST = AF 90° WJDG: Manufacturer: SHOU HAN(首韩); Add into BOM: yes; Gender: 母; Number of Ports: 1; Number of Contacts: 4P; Current Rating - Power (Max): 1.5A; Name: AF 90° WJDG; Symbol: AF 90° WJDG; Device: AF 90° WJDG; LCSC Part Name: Type-A 母 弯插; Supplier Part: C456018; Manufacturer Part: AF 90° WJDG; Supplier Footprint: 插件; JLCPCB Part Class: Extended Part; Datasheet: https://atta.szlcsc.com/upload/public/pdf/source/20191113/C456018_B104E062BEB8E11E57E63560E04EE13A.pdf; Supplier: LCSC; Convert to PCB: yes; Connector Type: Type-A; Standard: USB 2.0; Mounting Style: 弯插; Operating Temperature Range: -25℃~+85℃

## Sheet CONNECTOR_DBG.SchDoc: CONNECTOR
size A4; Revision: V2.0; SheetNumber: 6; SheetTotal: 7; Project: PY32F403v1xT_START
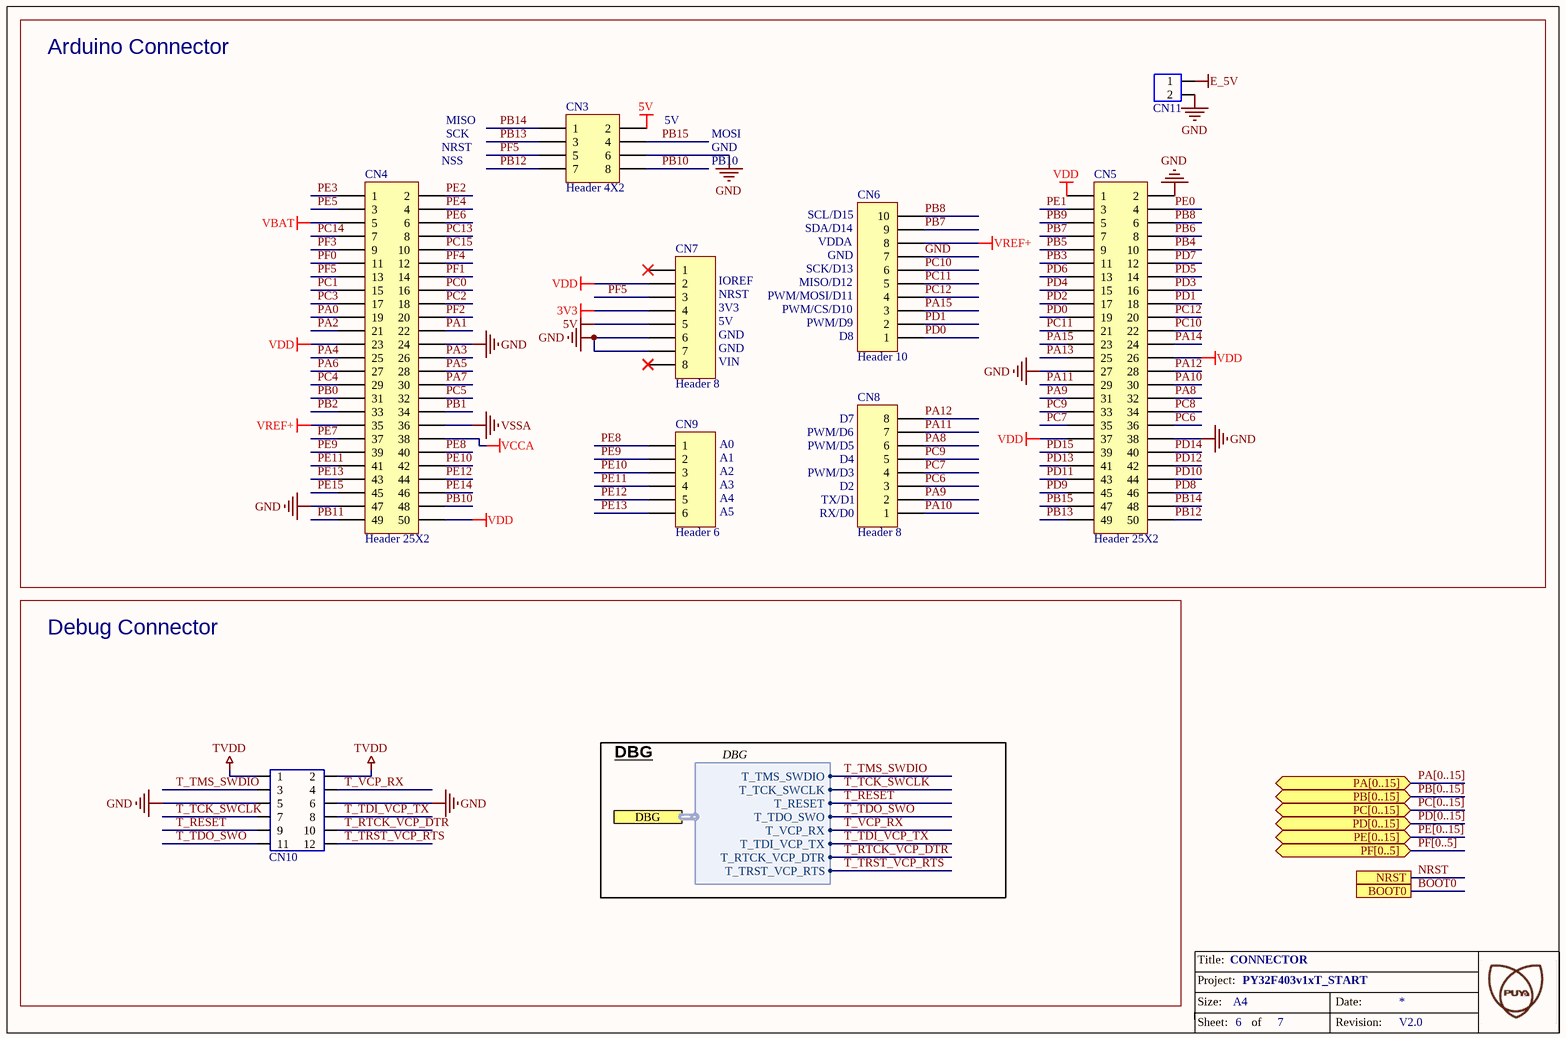
[diagram p5: CONNECTOR_DBG.SchDoc]

### Parts
CN3  Header 4X2  [HDR2X4]
CN4  Header 25X2  [HDR2X25]
CN5  Header 25X2  [HDR2X25]
CN6  Header 10  [1*10P_FEMALE]
CN7  Header 8  [1*8P_FEMALE]
CN8  Header 8  [1*8P_FEMALE]
CN9  Header 6  [1*6P_FEMALE]
CN10  CON6x2  [CON6x2]  (value not drawn)
CN11  CON2  [CON2]  (value not drawn)

### Blocks framed on the sheet
Arduino Connector: CN3-CN9 CN11
Debug Connector: CN10

### Ports
BOOT0, DBG (harness DBG), NRST, PA[0..15] (bidir), PB[0..15] (bidir), PC[0..15] (bidir), PD[0..15] (bidir), PE[0..15] (bidir), PF[0..5] (bidir)

### Harnesses
DBG: T_VCP_RX, T_TDO_SWO, T_RESET, T_TMS_SWDIO, T_TDI_VCP_TX, T_TCK_SWCLK, T_RTCK_VCP_DTR, T_TRST_VCP_RTS

### Nets
3V3: CN7.4
5V: CN3.2 CN7.5
E_5V: CN11.1
GND: CN3.6 CN4.24 CN4.47 CN5.2 CN5.27 CN5.38 CN6.7 CN7.6 CN7.7 CN10.5 CN10.6 CN11.2
TVDD: CN10.1 CN10.2
VBAT: CN4.5
VCCA: CN4.38
VDD: CN4.23 CN4.50 CN5.1 CN5.26 CN5.37 CN7.2
VREF+: CN4.35 CN6.8
VSSA: CN4.36
BOOT0: CN5.6 CN6.10 ; port BOOT0  [also labelled PB8]
PA0: CN4.19
PA1: CN4.22
PA2: CN4.21
PA3: CN4.26
PA4: CN4.25
PA5: CN4.28
PA6: CN4.27
PA7: CN4.30
PA8: CN5.32 CN8.6
PA9: CN5.31 CN8.2
PA10: CN5.30 CN8.1
PA11: CN5.29 CN8.7
PA12: CN5.28 CN8.8
PA13: CN5.25
PA14: CN5.24
PA15: CN5.23 CN6.3
PB0: CN4.31
PB1: CN4.34
PB2: CN4.33
PB3: CN5.11
PB4: CN5.10
PB5: CN5.9
PB6: CN5.8
PB7: CN5.7 CN6.9
PB9: CN5.5
PB10: CN3.8 CN4.48
PB11: CN4.49
PB12: CN3.7 CN5.50
PB13: CN3.3 CN5.49
PB14: CN3.1 CN5.48
PB15: CN3.4 CN5.47
PC0: CN4.16
PC1: CN4.15
PC2: CN4.18
PC3: CN4.17
PC4: CN4.29
PC5: CN4.32
PC6: CN5.36 CN8.3
PC7: CN5.35 CN8.4
PC8: CN5.34
PC9: CN5.33 CN8.5
PC10: CN5.22 CN6.6
PC11: CN5.21 CN6.5
PC12: CN5.20 CN6.4
PC13: CN4.8
PC14: CN4.7
PC15: CN4.10
PD0: CN5.19 CN6.1
PD1: CN5.18 CN6.2
PD2: CN5.17
PD3: CN5.16
PD4: CN5.15
PD5: CN5.14
PD6: CN5.13
PD7: CN5.12
PD8: CN5.46
PD9: CN5.45
PD10: CN5.44
PD11: CN5.43
PD12: CN5.42
PD13: CN5.41
PD14: CN5.40
PD15: CN5.39
PE0: CN5.4
PE1: CN5.3
PE2: CN4.2
PE3: CN4.1
PE4: CN4.4
PE5: CN4.3
PE6: CN4.6
PE7: CN4.37
PE8: CN4.40 CN9.1
PE9: CN4.39 CN9.2
PE10: CN4.42 CN9.3
PE11: CN4.41 CN9.4
PE12: CN4.44 CN9.5
PE13: CN4.43 CN9.6
PE14: CN4.46
PE15: CN4.45
PF0: CN4.11
PF1: CN4.14
PF2: CN4.20
PF3: CN4.9
PF4: CN4.12
PF5: CN3.5 CN4.13 CN7.3
T_RESET: CN10.9 ; port DBG.T_RESET
T_RTCK_VCP_DTR: CN10.10 ; port DBG.T_RTCK_VCP_DTR
T_TCK_SWCLK: CN10.7 ; port DBG.T_TCK_SWCLK
T_TDI_VCP_TX: CN10.8 ; port DBG.T_TDI_VCP_TX
T_TDO_SWO: CN10.11 ; port DBG.T_TDO_SWO
T_TMS_SWDIO: CN10.3 ; port DBG.T_TMS_SWDIO
T_TRST_VCP_RTS: CN10.12 ; port DBG.T_TRST_VCP_RTS
T_VCP_RX: CN10.4 ; port DBG.T_VCP_RX

Not connected (* = marked no-connect by the designer): CN7 1* 8*

### Buses and harness runs
bus PA[0..15] = port PA[0..15]
bus PB[0..15] = port PB[0..15]
bus PC[0..15] = port PC[0..15]
bus PD[0..15] = port PD[0..15]
bus PE[0..15] = port PE[0..15]
bus PF[0..5] = port PF[0..5]

### Notes on the sheet
- (near CN4) NRST
- (near CN4) NSS
- MISO
- SCK
- (near CN3) 5V
- MOSI
- GND
- PB10
- (near CN6) SDA/D14
- (near CN6) SCL/D15
- VDDA
- (near CN7) IOREF
- (near CN7) NRST
- (near CN7) 3V3
- PWM/MOSI/D11
- PWM/CS/D10
- (near CN6) MISO/D12
- (near CN6) SCK/D13
- (near CN6) GND
- (near CN7) 5V
- (near CN7) GND
- (near CN7) VIN
- PWM/D9
- (near CN6) D8
- (near CN9) A0
- PWM/D6
- PWM/D5
- (near CN8) D7
- (near CN9) A1
- (near CN9) A2
- (near CN9) A3
- (near CN9) A4
- (near CN9) A5
- (near CN8) PWM/D3
- (near CN8) RX/D0
- (near CN8) TX/D1
- (near CN8) D4
- (near CN8) D2
- DBG
- Title:
- Project:
- Size:
- Sheet:
- of
- Date:
- Revision:

### Library data of the parts
CN3 = Header 4X2: Header, 4-Pin, Dual row; LatestRevisionDate: 17-Jul-2002; LatestRevisionNote: Re-released for DXP Platform.; Publisher: Altium Limited
CN4 CN5 = Header 25X2: Header, 25-Pin, Dual row; LatestRevisionDate: 17-Jul-2002; LatestRevisionNote: Re-released for DXP Platform.; Publisher: Altium Limited
CN6 = Header 10: Header, 10-Pin; LatestRevisionDate: 17-Jul-2002; LatestRevisionNote: Re-released for DXP Platform.; Publisher: Altium Limited
CN7 CN8 = Header 8: Header, 8-Pin; LatestRevisionDate: 17-Jul-2002; LatestRevisionNote: Re-released for DXP Platform.; Publisher: Altium Limited
CN9 = Header 6: Header, 6-Pin; LatestRevisionDate: 17-Jul-2002; LatestRevisionNote: Re-released for DXP Platform.; Publisher: Altium Limited
CN10 = CON6x2: PCB DECAL: CON5x2

## Sheet POWER.SchDoc: POWER_USB
size A4; Revision: V2.0; SheetNumber: 4; SheetTotal: 7; Project: PY32F403v1xT_START
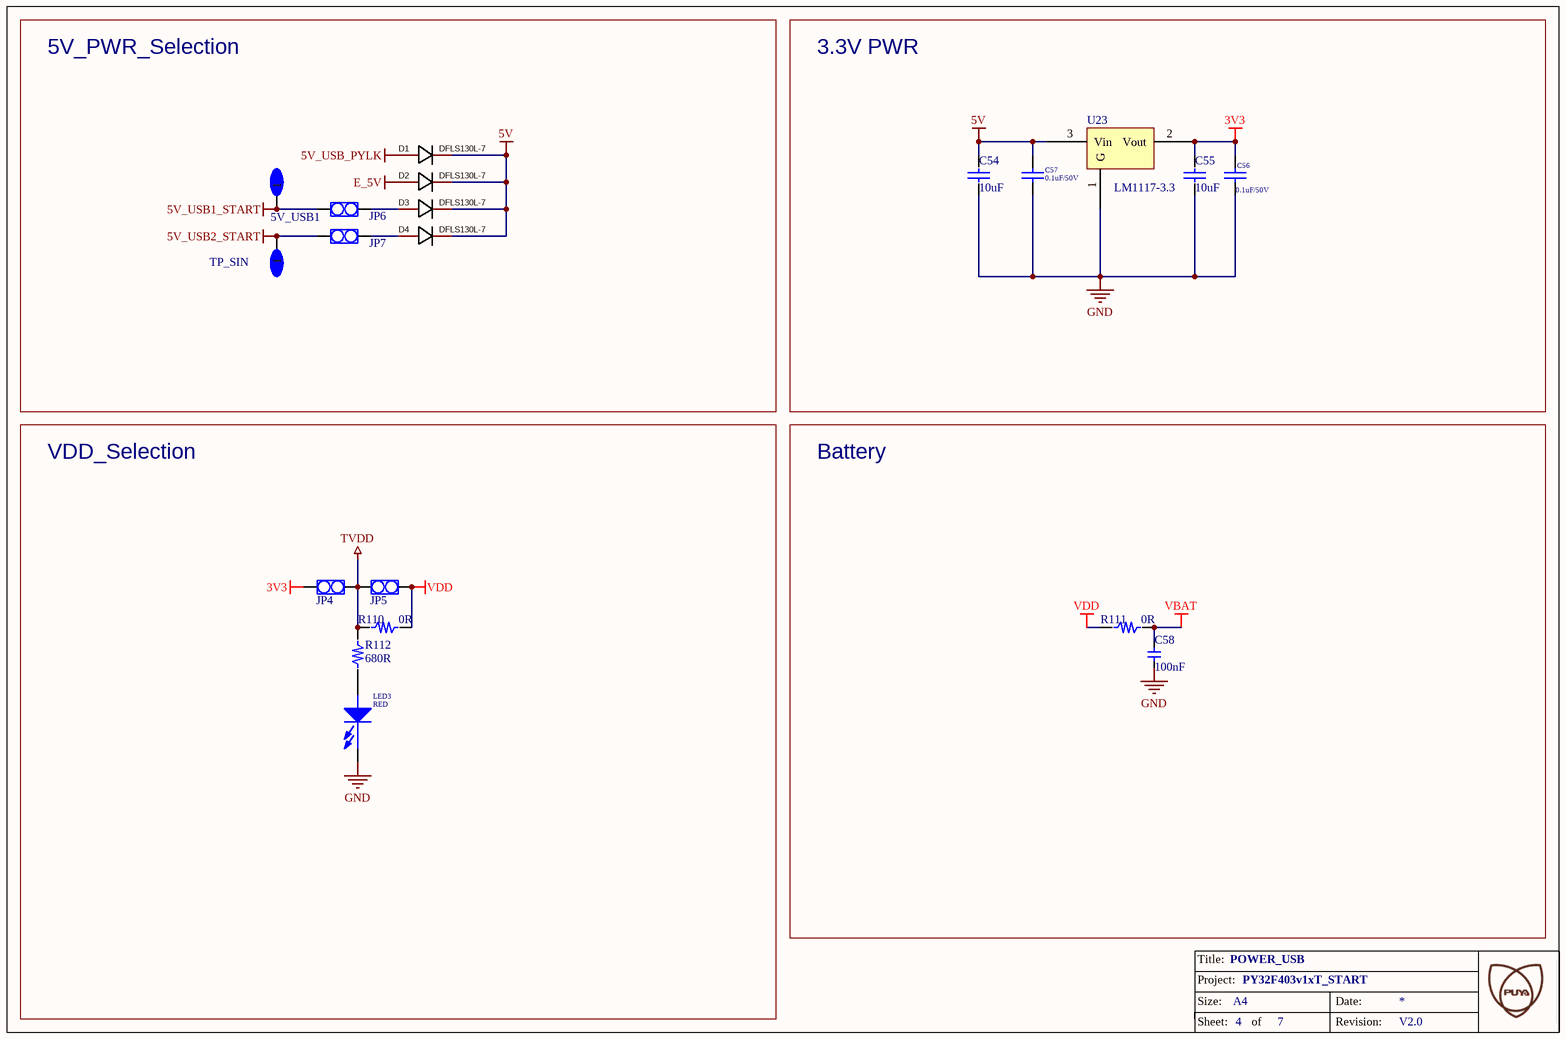
[diagram p6: POWER.SchDoc]

### Parts
5V_USB1  TP_SIN  [TP_SIN]  (value not drawn)
5V_USB2  TP_SIN  [TP_SIN]
C54  10uF  [C0805]
C55  10uF  [C0805]
C56  0.1uF/50V  [c0603cap]
C57  0.1uF/50V  [c0603cap]
C58  100nF  [C0603]
D1  DFLS130L-7  [POWERDI-123_L2.8-W1.8-LS3.7-RD]
D2  DFLS130L-7  [POWERDI-123_L2.8-W1.8-LS3.7-RD]
D3  DFLS130L-7  [POWERDI-123_L2.8-W1.8-LS3.7-RD]
D4  DFLS130L-7  [POWERDI-123_L2.8-W1.8-LS3.7-RD]
JP4  CON2  [CON2]  (value not drawn)
JP5  CON2/NC  [CON2]  (value not drawn)
JP6  CON2  [CON2]  (value not drawn)
JP7  CON2  [CON2]  (value not drawn)
LED3  RED  [0603_LED]
R110  0R  [R0603]
R111  0R  [R0603]
R112  680R  [R0603]
U23  LM1117-3.3  [LM1117-3.3]

### Blocks framed on the sheet
5V_PWR_Selection: 5V_USB1 5V_USB2 D1-D4 JP6 JP7
3.3V PWR: C54-C57 U23
VDD_Selection: JP4 JP5 LED3 R110 R112
Battery: C58 R111

### Nets
3V3: C55.2 C56.2 JP4.1 U23.2(Vout)
5V: C54.2 C57.2 D1.1 D2.1 D3.1 D4.1 U23.3(Vin)
5V_USB1_START: 5V_USB1.1 JP6.1
5V_USB2_START: 5V_USB2.1 JP7.1
5V_USB_PYLK: D1.2
E_5V: D2.2
GND: C54.1 C55.1 C56.1 C57.1 C58.1 LED3.2(CATHODE) U23.1(G)
TVDD: JP4.2 JP5.1 R110.1 R112.2
VBAT: C58.2 R111.2
VDD: JP5.2 R110.2 R111.1
NetD3_2: D3.2 JP6.2
NetD4_2: D4.2 JP7.2
NetLED3_1: LED3.1(ANODE) R112.1

### Notes on the sheet
- Title:
- Project:
- Size:
- Sheet:
- A4
- of
- Date:
- Revision:

### Library data of the parts
C54 C55 = C0805: PCB DECAL: 0805
C56 = Cap: Capacitor; Published: 8-Jun-2000; Revision: July-2002: Re-released for DXP Platform.; Publisher: Altium Limited; Value: 0.1uF/50V
C57 = CAP: Capacitor; Value: 2.2uF; Published: 8-Jun-2000; Publisher: Altium Limited; LatestRevisionDate: 17-Jul-2002; LatestRevisionNote: Re-released for DXP Platform.; PackageReference: RAD-0.3
C58 = C0603: PCB DECAL: 0603
D1-D4 = DFLS130L-7: Manufacturer: DIODES(美台); Add into BOM: yes; Forward Voltage (Vf@If): 310mV@1A; Reverse Voltage (Vr): 30V; Average Rectified Current (Io): 1A; Name: DFLS130L-7; Symbol: DFLS130L-7; Device: DFLS130L-7; LCSC Part Name: 电压:30V 电流:1A; Supplier Part: C110493; Manufacturer Part: DFLS130L-7; Supplier Footprint: Power-DI-123; JLCPCB Part Class: Extended Part; Datasheet: https://atta.szlcsc.com/upload/public/pdf/source/20170427/1493286393645.pdf; Supplier: LCSC; Convert to PCB: yes
JP4-JP7 = CON2_DIP
LED3 = PDI-E803_Dup1
R110-R112 = R0603: PCB DECAL: 0603

## Nets that join several sheets
3V3: CONNECTOR_DBG (CN7.4), POWER (C55.2 C56.2 JP4.1 U23.2)
5V: PERIPHERA (5 pins), CONNECTOR_DBG (CN3.2 CN7.5), POWER (7 pins)
5V_USB1_START: PERIPHERA (C60.2 R89.2 U24.1 USB1.1), POWER (5V_USB1.1 JP6.1)
5V_USB2_START: PERIPHERA (C62.2 R96.2 U25.1 USB2.1), POWER (5V_USB2.1 JP7.1)
5V_USB_PYLK: PYLink (C15.2 JP1.3 U16.1), POWER (D1.2)
E_5V: CONNECTOR_DBG (CN11.1), POWER (D2.2)
GND: PYLink (63 pins), MCU (21 pins), ETH (24 pins), PERIPHERA (24 pins), CONNECTOR_DBG (12 pins), POWER (7 pins)
TVDD: PYLink (18 pins), CONNECTOR_DBG (CN10.1 CN10.2), POWER (JP4.2 JP5.1 R110.1 R112.2)
VBAT: MCU (U18.6), CONNECTOR_DBG (CN4.5), POWER (C58.2 R111.2)
VCCA: MCU (5 pins), CONNECTOR_DBG (CN4.38)
VDD: MCU (16 pins), ETH (R97.1), PERIPHERA (7 pins), CONNECTOR_DBG (6 pins), POWER (JP5.2 R110.2 R111.1)
VDD_FLASH: MCU (R48.2 R49.2), PERIPHERA (R88.2 R90.2 U21.8)
VREF+: MCU (5 pins), CONNECTOR_DBG (CN4.35 CN6.8)
VSSA: MCU (6 pins), CONNECTOR_DBG (CN4.36)
BOOT0: MCU (R65.2 U18.95), CONNECTOR_DBG (CN5.6 CN6.10)
ESMC_CLK: MCU (R44.1 R51.1), PERIPHERA (U21.6)
ESMC_CS: MCU (R43.1 R50.1), PERIPHERA (R90.1 U21.1)
ESMC_IO0: MCU (R47.1 R52.1), PERIPHERA (U21.5)
ESMC_IO1: MCU (R46.1 R53.1), PERIPHERA (U21.2)
ESMC_IO2: MCU (R48.1 R55.1), PERIPHERA (U21.3)
ESMC_IO3: MCU (R49.1 R56.1), PERIPHERA (U21.7)
LAN8720_CRS_DV: MCU (R58.1), ETH (U22.11)
LAN8720_MCO: MCU (R69.1), ETH (R108.2)
LAN8720_MDC: MCU (R61.1), ETH (U22.13)
LAN8720_MDIO: MCU (R66.1), ETH (U22.12)
LAN8720_nINT: MCU (R67.1), ETH (U22.14)
LAN8720_nRST: MCU (R68.1), ETH (U22.15)
LAN8720_RXD0: MCU (R59.1), ETH (U22.8)
LAN8720_RXD1: MCU (R60.1), ETH (U22.7)
LAN8720_TXD0: MCU (R62.1), ETH (U22.17)
LAN8720_TXD1: MCU (R63.1), ETH (U22.18)
LAN8720_TXEN: MCU (R64.1), ETH (U22.16)
PA0: MCU (U18.20), CONNECTOR_DBG (CN4.19)
PA1: MCU (R67.2 U18.21), CONNECTOR_DBG (CN4.22)
PA2: MCU (R66.2 U18.22), CONNECTOR_DBG (CN4.21)
PA3: MCU (R51.2 U18.25), CONNECTOR_DBG (CN4.26)
PA4: MCU (R43.2 U18.26), CONNECTOR_DBG (CN4.25)
PA5: MCU (U18.27), PERIPHERA (R114.2), CONNECTOR_DBG (CN4.28)
PA6: MCU (R46.2 R56.2 U18.28), CONNECTOR_DBG (CN4.27)
PA7: MCU (R47.2 R55.2 U18.29), CONNECTOR_DBG (CN4.30)
PA8: MCU (R69.2 U18.69), CONNECTOR_DBG (CN5.32 CN8.6)
PA9: MCU (JP3.3 U18.70), CONNECTOR_DBG (CN5.31 CN8.2)
PA10: MCU (JP3.4 U18.71), CONNECTOR_DBG (CN5.30 CN8.1)
PA11: MCU (U18.72), PERIPHERA (R87.1), CONNECTOR_DBG (CN5.29 CN8.7)
PA12: MCU (U18.73), PERIPHERA (R86.1), CONNECTOR_DBG (CN5.28 CN8.8)
PA13: MCU (R70.2 U18.76), CONNECTOR_DBG (CN5.25)
PA14: MCU (R71.2 U18.77), CONNECTOR_DBG (CN5.24)
PA15: MCU (R75.2 U18.78), CONNECTOR_DBG (CN5.23 CN6.3)
PB0: MCU (R53.2 U18.32), CONNECTOR_DBG (CN4.31)
PB1: MCU (R52.2 U18.33), CONNECTOR_DBG (CN4.34)
PB2: MCU (U18.34), CONNECTOR_DBG (CN4.33)
PB3: MCU (R44.2 R73.2 U18.90), CONNECTOR_DBG (CN5.11)
PB4: MCU (R76.2 U18.91), CONNECTOR_DBG (CN5.10)
PB5: MCU (R81.2 U18.92), CONNECTOR_DBG (CN5.9)
PB6: MCU (R79.2 U18.93), CONNECTOR_DBG (CN5.8)
PB7: MCU (U18.94), PERIPHERA (R83.1), CONNECTOR_DBG (CN5.7 CN6.9)
PB9: MCU (U18.96), CONNECTOR_DBG (CN5.5)
PB10: MCU (U18.47), CONNECTOR_DBG (CN3.8 CN4.48)
PB11: MCU (R64.2 U18.50), CONNECTOR_DBG (CN4.49)
PB12: MCU (R62.2 U18.51), CONNECTOR_DBG (CN3.7 CN5.50)
PB13: MCU (R63.2 U18.52), CONNECTOR_DBG (CN3.3 CN5.49)
PB14: MCU (U18.53), CONNECTOR_DBG (CN3.1 CN5.48)
PB15: MCU (U18.54), CONNECTOR_DBG (CN3.4 CN5.47)
PC0: MCU (U18.15), PERIPHERA (R95.1), CONNECTOR_DBG (CN4.16)
PC1: MCU (R61.2 U18.16), PERIPHERA (R94.1), CONNECTOR_DBG (CN4.15)
PC2: MCU (U18.17), PERIPHERA (R92.1), CONNECTOR_DBG (CN4.18)
PC3: MCU (U18.18), PERIPHERA (R96.1), CONNECTOR_DBG (CN4.17)
PC4: MCU (R59.2 U18.30), CONNECTOR_DBG (CN4.29)
PC5: MCU (R60.2 U18.31), CONNECTOR_DBG (CN4.32)
PC6: MCU (U18.65), CONNECTOR_DBG (CN5.36 CN8.3)
PC7: MCU (U18.66), CONNECTOR_DBG (CN5.35 CN8.4)
PC8: MCU (R68.2 U18.67), CONNECTOR_DBG (CN5.34)
PC9: MCU (U18.68), CONNECTOR_DBG (CN5.33 CN8.5)
PC10: MCU (R80.2 U18.79), CONNECTOR_DBG (CN5.22 CN6.6)
PC11: MCU (U18.80), CONNECTOR_DBG (CN5.21 CN6.5)
PC12: MCU (U18.81), CONNECTOR_DBG (CN5.20 CN6.4)
PC13: MCU (U18.7), CONNECTOR_DBG (CN4.8)
PC14: MCU (R37.1), CONNECTOR_DBG (CN4.7)
PC15: MCU (R38.1), CONNECTOR_DBG (CN4.10)
PD0: MCU (U18.82), CONNECTOR_DBG (CN5.19 CN6.1)
PD1: MCU (U18.83), CONNECTOR_DBG (CN5.18 CN6.2)
PD2: MCU (R50.2 U18.84), CONNECTOR_DBG (CN5.17)
PD3: MCU (U18.85), CONNECTOR_DBG (CN5.16)
PD4: MCU (U18.86), CONNECTOR_DBG (CN5.15)
PD5: MCU (U18.87), CONNECTOR_DBG (CN5.14)
PD6: MCU (U18.88), CONNECTOR_DBG (CN5.13)
PD7: MCU (U18.89), CONNECTOR_DBG (CN5.12)
PD8: MCU (R58.2 U18.55), CONNECTOR_DBG (CN5.46)
PD9: MCU (U18.56), PERIPHERA (R91.1), CONNECTOR_DBG (CN5.45)
PD10: MCU (U18.57), PERIPHERA (R117.2), CONNECTOR_DBG (CN5.44)
PD11: MCU (U18.58), CONNECTOR_DBG (CN5.43)
PD12: MCU (U18.59), CONNECTOR_DBG (CN5.42)
PD13: MCU (U18.60), CONNECTOR_DBG (CN5.41)
PD14: MCU (U18.61), CONNECTOR_DBG (CN5.40)
PD15: MCU (U18.62), CONNECTOR_DBG (CN5.39)
PE0: MCU (U18.97), CONNECTOR_DBG (CN5.4)
PE1: MCU (U18.98), CONNECTOR_DBG (CN5.3)
PE2: MCU (U18.1), CONNECTOR_DBG (CN4.2)
PE3: MCU (U18.2), CONNECTOR_DBG (CN4.1)
PE4: MCU (U18.3), CONNECTOR_DBG (CN4.4)
PE5: MCU (U18.4), CONNECTOR_DBG (CN4.3)
PE6: MCU (U18.5), CONNECTOR_DBG (CN4.6)
PE7: MCU (U18.38), CONNECTOR_DBG (CN4.37)
PE8: MCU (U18.39), CONNECTOR_DBG (CN4.40 CN9.1)
PE9: MCU (U18.40), CONNECTOR_DBG (CN4.39 CN9.2)
PE10: MCU (U18.41), CONNECTOR_DBG (CN4.42 CN9.3)
PE11: MCU (U18.42), CONNECTOR_DBG (CN4.41 CN9.4)
PE12: MCU (U18.43), CONNECTOR_DBG (CN4.44 CN9.5)
PE13: MCU (U18.44), CONNECTOR_DBG (CN4.43 CN9.6)
PE14: MCU (U18.45), CONNECTOR_DBG (CN4.46)
PE15: MCU (U18.46), CONNECTOR_DBG (CN4.45)
PF0: MCU (R40.1), CONNECTOR_DBG (CN4.11)
PF1: MCU (R41.1), CONNECTOR_DBG (CN4.14)
PF2: MCU (U18.19), CONNECTOR_DBG (CN4.20)
PF3: MCU (U18.10), CONNECTOR_DBG (CN4.9)
PF4: MCU (U18.11), CONNECTOR_DBG (CN4.12)
PF5: MCU (R54.2 U18.14), CONNECTOR_DBG (CN3.5 CN4.13 CN7.3)
T_RESET: PYLink (CN1.9 R17.2 U4.4), MCU (R72.1), CONNECTOR_DBG (CN10.9)
T_RTCK_VCP_DTR: PYLink (CN1.10 R9.2 U3.5), CONNECTOR_DBG (CN10.10)
T_TCK_SWCLK: PYLink (CN1.7 R6.2 U4.5), MCU (R71.1), CONNECTOR_DBG (CN10.7)
T_TDI_VCP_TX: PYLink (CN1.8 R21.2 U3.4), MCU (JP3.6 R75.1), CONNECTOR_DBG (CN10.8)
T_TDO_SWO: PYLink (CN1.11 R12.2 U4.3), MCU (R73.1), CONNECTOR_DBG (CN10.11)
T_TMS_SWDIO: PYLink (CN1.3 R2.2 U4.1), CONNECTOR_DBG (CN10.3)
T_TRST_VCP_RTS: PYLink (CN1.12 R13.2 U3.1), MCU (R76.1), CONNECTOR_DBG (CN10.12)
T_VCP_RX: PYLink (CN1.4 R22.1 R24.2 U3.3), MCU (JP3.5), CONNECTOR_DBG (CN10.4)
USB1_ID: MCU (JP3.2), PERIPHERA (R84.1)
USB1_VBUS: MCU (JP3.1), PERIPHERA (R89.1)
USER_KEY: MCU (R79.1), PERIPHERA (C39.2 K3.1 R82.2 U20.1)
USER_LED: MCU (R80.1 R81.1), PERIPHERA (LED2.2)